# Altium project Membrane_Board.PrjPcb (part 1 of 2)
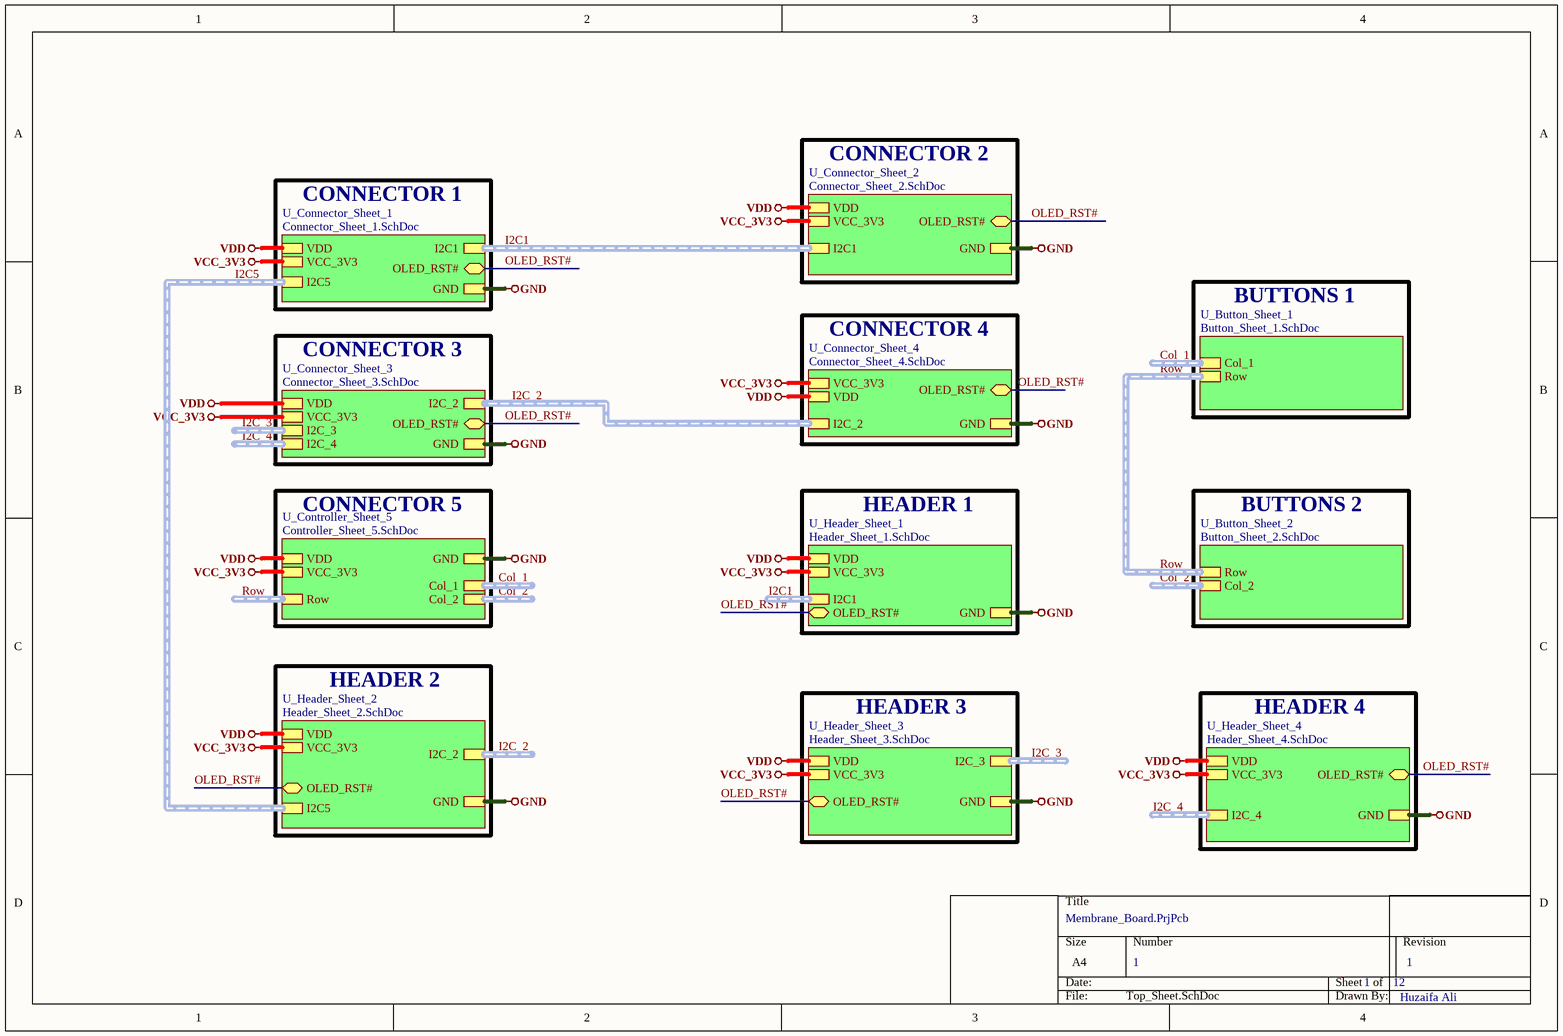
[diagram p0: Top_Sheet.SchDoc]
12 sheets, 247 parts. Net scope: hierarchical (ports join the sheet entries above them; power ports are global).
Board file: Membrane_Board_Latest.PcbDoc
Sheets:
  Top_Sheet.SchDoc
    U_Connector_Sheet_1 = Connector_Sheet_1.SchDoc
    U_Connector_Sheet_2 = Connector_Sheet_2.SchDoc
    U_Connector_Sheet_3 = Connector_Sheet_3.SchDoc
    U_Connector_Sheet_4 = Connector_Sheet_4.SchDoc
    U_Controller_Sheet_5 = Controller_Sheet_5.SchDoc
    U_Header_Sheet_1 = Header_Sheet_1.SchDoc
    U_Header_Sheet_2 = Header_Sheet_2.SchDoc
    U_Header_Sheet_3 = Header_Sheet_3.SchDoc
    U_Header_Sheet_4 = Header_Sheet_4.SchDoc
    U_Button_Sheet_1 = Button_Sheet_1.SchDoc
    U_Button_Sheet_2 = Button_Sheet_2.SchDoc

## Sheet Top_Sheet.SchDoc
size A4; SheetNumber: 1; SheetTotal: 12

### Sub-sheets
U_Button_Sheet_1 = Button_Sheet_1.SchDoc: Col_1 (harness Col_1), Row (harness Row)
U_Button_Sheet_2 = Button_Sheet_2.SchDoc: Col_2 (harness Col_2), Row (harness Row)
U_Connector_Sheet_1 = Connector_Sheet_1.SchDoc: I2C1 (harness I2C1), VDD, VCC_3V3, GND, OLED_RST# (bidir), I2C5 (harness I2C5)
U_Connector_Sheet_2 = Connector_Sheet_2.SchDoc: I2C1 (harness I2C1), VDD, VCC_3V3, GND, OLED_RST# (bidir)
U_Connector_Sheet_3 = Connector_Sheet_3.SchDoc: VDD, VCC_3V3, GND, I2C_2 (harness I2C_2), OLED_RST# (bidir), I2C_3 (harness I2C_3), I2C_4 (harness I2C_4)
U_Connector_Sheet_4 = Connector_Sheet_4.SchDoc: I2C_2 (harness I2C_2), VDD, VCC_3V3, GND, OLED_RST# (bidir)
U_Controller_Sheet_5 = Controller_Sheet_5.SchDoc: VDD, VCC_3V3, GND, Col_1 (harness Col_1), Row (harness Row), Col_2 (harness Col_2)
U_Header_Sheet_1 = Header_Sheet_1.SchDoc: VDD, VCC_3V3, GND, I2C1 (harness I2C1), OLED_RST# (bidir)
U_Header_Sheet_2 = Header_Sheet_2.SchDoc: VDD, VCC_3V3, GND, OLED_RST# (bidir), I2C_2 (harness I2C_2), I2C5 (harness I2C5)
U_Header_Sheet_3 = Header_Sheet_3.SchDoc: I2C_3 (harness I2C_3), VDD, VCC_3V3, GND, OLED_RST# (bidir)
U_Header_Sheet_4 = Header_Sheet_4.SchDoc: OLED_RST# (bidir), I2C_4 (harness I2C_4), VDD, VCC_3V3, GND

### Nets
GND: sheet U_Connector_Sheet_1/GND, sheet U_Connector_Sheet_2/GND, sheet U_Connector_Sheet_3/GND, sheet U_Connector_Sheet_4/GND, sheet U_Controller_Sheet_5/GND, sheet U_Header_Sheet_1/GND, sheet U_Header_Sheet_2/GND, sheet U_Header_Sheet_3/GND, sheet U_Header_Sheet_4/GND
VCC_3V3: sheet U_Connector_Sheet_1/VCC_3V3, sheet U_Connector_Sheet_2/VCC_3V3, sheet U_Connector_Sheet_3/VCC_3V3, sheet U_Connector_Sheet_4/VCC_3V3, sheet U_Controller_Sheet_5/VCC_3V3, sheet U_Header_Sheet_1/VCC_3V3, sheet U_Header_Sheet_2/VCC_3V3, sheet U_Header_Sheet_3/VCC_3V3, sheet U_Header_Sheet_4/VCC_3V3
VDD: sheet U_Connector_Sheet_1/VDD, sheet U_Connector_Sheet_2/VDD, sheet U_Connector_Sheet_3/VDD, sheet U_Connector_Sheet_4/VDD, sheet U_Controller_Sheet_5/VDD, sheet U_Header_Sheet_1/VDD, sheet U_Header_Sheet_2/VDD, sheet U_Header_Sheet_3/VDD, sheet U_Header_Sheet_4/VDD
OLED_RST#: sheet U_Connector_Sheet_1/OLED_RST#, sheet U_Connector_Sheet_2/OLED_RST#, sheet U_Connector_Sheet_3/OLED_RST#, sheet U_Connector_Sheet_4/OLED_RST#, sheet U_Header_Sheet_1/OLED_RST#, sheet U_Header_Sheet_2/OLED_RST#, sheet U_Header_Sheet_3/OLED_RST#, sheet U_Header_Sheet_4/OLED_RST#

### Buses and harness runs
harness Col_1 = sheet U_Button_Sheet_1/Col_1
harness Col_1 = sheet U_Controller_Sheet_5/Col_1
harness Col_2 = sheet U_Button_Sheet_2/Col_2
harness Col_2 = sheet U_Controller_Sheet_5/Col_2
harness I2C1 = sheet U_Connector_Sheet_1/I2C1 = sheet U_Connector_Sheet_2/I2C1
harness I2C1 = sheet U_Header_Sheet_1/I2C1
harness I2C5 = sheet U_Connector_Sheet_1/I2C5 = sheet U_Header_Sheet_2/I2C5
harness I2C_2 = sheet U_Connector_Sheet_3/I2C_2 = sheet U_Connector_Sheet_4/I2C_2
harness I2C_2 = sheet U_Header_Sheet_2/I2C_2
harness I2C_3 = sheet U_Connector_Sheet_3/I2C_3
harness I2C_3 = sheet U_Header_Sheet_3/I2C_3
harness I2C_4 = sheet U_Connector_Sheet_3/I2C_4
harness I2C_4 = sheet U_Header_Sheet_4/I2C_4
harness Row = sheet U_Button_Sheet_1/Row = sheet U_Button_Sheet_2/Row
harness Row = sheet U_Controller_Sheet_5/Row

### Notes on the sheet
- CONNECTOR 2
- CONNECTOR 1
- BUTTONS 1
- CONNECTOR 3
- CONNECTOR 4
- CONNECTOR 5
- HEADER 1
- BUTTONS 2
- HEADER 2
- HEADER 3
- HEADER 4
- 1
- Huzaifa Ali

## Sheet Connector_Sheet_1.SchDoc
size A4; SheetNumber: 2; SheetTotal: 12
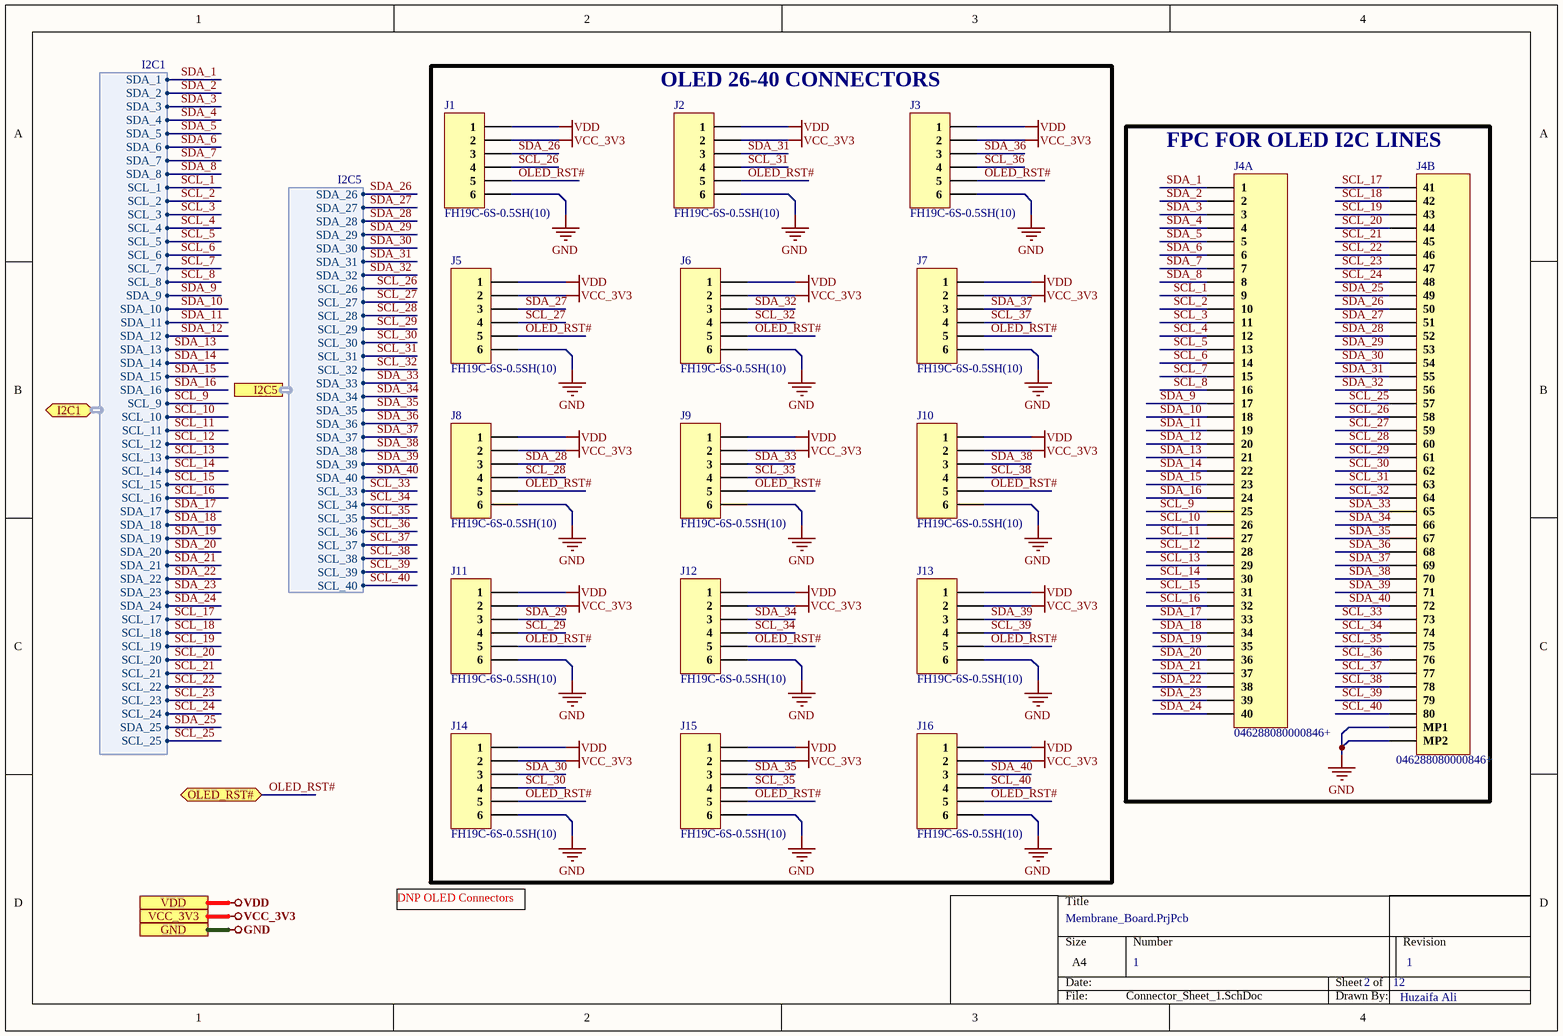
[diagram p1: Connector_Sheet_1.SchDoc]

### Parts
J1  FH19C-6S-0.5SH(10)  [FH19C-6S-0.5SH(10)]
J2  FH19C-6S-0.5SH(10)  [FH19C-6S-0.5SH(10)]
J3  FH19C-6S-0.5SH(10)  [FH19C-6S-0.5SH(10)]
J4  046288080000846+  [046288080000846+]  (parts A,B of 2)
J5  FH19C-6S-0.5SH(10)  [FH19C-6S-0.5SH(10)]
J6  FH19C-6S-0.5SH(10)  [FH19C-6S-0.5SH(10)]
J7  FH19C-6S-0.5SH(10)  [FH19C-6S-0.5SH(10)]
J8  FH19C-6S-0.5SH(10)  [FH19C-6S-0.5SH(10)]
J9  FH19C-6S-0.5SH(10)  [FH19C-6S-0.5SH(10)]
J10  FH19C-6S-0.5SH(10)  [FH19C-6S-0.5SH(10)]
J11  FH19C-6S-0.5SH(10)  [FH19C-6S-0.5SH(10)]
J12  FH19C-6S-0.5SH(10)  [FH19C-6S-0.5SH(10)]
J13  FH19C-6S-0.5SH(10)  [FH19C-6S-0.5SH(10)]
J14  FH19C-6S-0.5SH(10)  [FH19C-6S-0.5SH(10)]
J15  FH19C-6S-0.5SH(10)  [FH19C-6S-0.5SH(10)]
J16  FH19C-6S-0.5SH(10)  [FH19C-6S-0.5SH(10)]

### Blocks framed on the sheet
OLED 26-40 CONNECTORS: J1-J3 J5-J16
FPC FOR OLED I2C LINES: J4

### Ports
GND, I2C1 (bidir, harness I2C1), I2C5 (harness I2C5), OLED_RST# (bidir), VCC_3V3, VDD

### Harnesses
I2C1: SDA_1, SDA_2, SDA_3, SDA_4, SDA_5, SDA_6, SDA_7, SDA_8, SCL_1, SCL_2, SCL_3, SCL_4, SCL_5, SCL_6, SCL_7, SCL_8, SDA_9, SDA_10, SDA_11, SDA_12, SDA_13, SDA_14, SDA_15, SDA_16, SCL_9, SCL_10, SCL_11, SCL_12, SCL_13, SCL_14, SCL_15, SCL_16, SDA_17, SDA_18, SDA_19, SDA_20, SDA_21, SDA_22, SDA_23, SDA_24, SCL_17, SCL_18, SCL_19, SCL_20, SCL_21, SCL_22, SCL_23, SCL_24, SDA_25, SCL_25
I2C5: SDA_26, SDA_27, SDA_28, SDA_29, SDA_30, SDA_31, SDA_32, SCL_26, SCL_27, SCL_28, SCL_29, SCL_30, SCL_31, SCL_32, SDA_33, SDA_34, SDA_35, SDA_36, SDA_37, SDA_38, SDA_39, SDA_40, SCL_33, SCL_34, SCL_35, SCL_36, SCL_37, SCL_38, SCL_39, SCL_40

### Nets
GND: J1.6 J2.6 J3.6 J4.MP1 J4.MP2 J5.6 J6.6 J7.6 J8.6 J9.6 J10.6 J11.6 J12.6 J13.6 J14.6 J15.6 J16.6 ; port GND
VCC_3V3: J1.2 J2.2 J3.2 J5.2 J6.2 J7.2 J8.2 J9.2 J10.2 J11.2 J12.2 J13.2 J14.2 J15.2 J16.2 ; port VCC_3V3
VDD: J1.1 J2.1 J3.1 J5.1 J6.1 J7.1 J8.1 J9.1 J10.1 J11.1 J12.1 J13.1 J14.1 J15.1 J16.1 ; port VDD
OLED_RST#: J1.5 J2.5 J3.5 J5.5 J6.5 J7.5 J8.5 J9.5 J10.5 J11.5 J12.5 J13.5 J14.5 J15.5 J16.5 ; port OLED_RST#
SCL_1: J4.9 ; port I2C1.SCL_1  [project net I2C1.SCL_1]
SCL_2: J4.10 ; port I2C1.SCL_2  [project net I2C1.SCL_2]
SCL_3: J4.11 ; port I2C1.SCL_3  [project net I2C1.SCL_3]
SCL_4: J4.12 ; port I2C1.SCL_4  [project net I2C1.SCL_4]
SCL_5: J4.13 ; port I2C1.SCL_5  [project net I2C1.SCL_5]
SCL_6: J4.14 ; port I2C1.SCL_6  [project net I2C1.SCL_6]
SCL_7: J4.15 ; port I2C1.SCL_7  [project net I2C1.SCL_7]
SCL_8: J4.16 ; port I2C1.SCL_8  [project net I2C1.SCL_8]
SCL_9: J4.25 ; port I2C1.SCL_9  [project net I2C1.SCL_9]
SCL_10: J4.26 ; port I2C1.SCL_10  [project net I2C1.SCL_10]
SCL_11: J4.27 ; port I2C1.SCL_11  [project net I2C1.SCL_11]
SCL_12: J4.28 ; port I2C1.SCL_12  [project net I2C1.SCL_12]
SCL_13: J4.29 ; port I2C1.SCL_13  [project net I2C1.SCL_13]
SCL_14: J4.30 ; port I2C1.SCL_14  [project net I2C1.SCL_14]
SCL_15: J4.31 ; port I2C1.SCL_15  [project net I2C1.SCL_15]
SCL_16: J4.32 ; port I2C1.SCL_16  [project net I2C1.SCL_16]
SCL_17: J4.41 ; port I2C1.SCL_17  [project net I2C1.SCL_17]
SCL_18: J4.42 ; port I2C1.SCL_18  [project net I2C1.SCL_18]
SCL_19: J4.43 ; port I2C1.SCL_19  [project net I2C1.SCL_19]
SCL_20: J4.44 ; port I2C1.SCL_20  [project net I2C1.SCL_20]
SCL_21: J4.45 ; port I2C1.SCL_21  [project net I2C1.SCL_21]
SCL_22: J4.46 ; port I2C1.SCL_22  [project net I2C1.SCL_22]
SCL_23: J4.47 ; port I2C1.SCL_23  [project net I2C1.SCL_23]
SCL_24: J4.48 ; port I2C1.SCL_24  [project net I2C1.SCL_24]
SCL_25: J4.57 ; port I2C1.SCL_25  [project net I2C1.SCL_25]
SCL_26: J1.4 J4.58 ; port I2C5.SCL_26  [project net I2C5.SCL_26]
SCL_27: J4.59 J5.4 ; port I2C5.SCL_27  [project net I2C5.SCL_27]
SCL_28: J4.60 J8.4 ; port I2C5.SCL_28  [project net I2C5.SCL_28]
SCL_29: J4.61 J11.4 ; port I2C5.SCL_29  [project net I2C5.SCL_29]
SCL_30: J4.62 J14.4 ; port I2C5.SCL_30  [project net I2C5.SCL_30]
SCL_31: J2.4 J4.63 ; port I2C5.SCL_31  [project net I2C5.SCL_31]
SCL_32: J4.64 J6.4 ; port I2C5.SCL_32  [project net I2C5.SCL_32]
SCL_33: J4.73 J9.4 ; port I2C5.SCL_33  [project net I2C5.SCL_33]
SCL_34: J4.74 J12.4 ; port I2C5.SCL_34  [project net I2C5.SCL_34]
SCL_35: J4.75 J15.4 ; port I2C5.SCL_35  [project net I2C5.SCL_35]
SCL_36: J3.4 J4.76 ; port I2C5.SCL_36  [project net I2C5.SCL_36]
SCL_37: J4.77 J7.4 ; port I2C5.SCL_37  [project net I2C5.SCL_37]
SCL_38: J4.78 J10.4 ; port I2C5.SCL_38  [project net I2C5.SCL_38]
SCL_39: J4.79 J13.4 ; port I2C5.SCL_39  [project net I2C5.SCL_39]
SCL_40: J4.80 J16.4 ; port I2C5.SCL_40  [project net I2C5.SCL_40]
SDA_1: J4.1 ; port I2C1.SDA_1  [project net I2C1.SDA_1]
SDA_2: J4.2 ; port I2C1.SDA_2  [project net I2C1.SDA_2]
SDA_3: J4.3 ; port I2C1.SDA_3  [project net I2C1.SDA_3]
SDA_4: J4.4 ; port I2C1.SDA_4  [project net I2C1.SDA_4]
SDA_5: J4.5 ; port I2C1.SDA_5  [project net I2C1.SDA_5]
SDA_6: J4.6 ; port I2C1.SDA_6  [project net I2C1.SDA_6]
SDA_7: J4.7 ; port I2C1.SDA_7  [project net I2C1.SDA_7]
SDA_8: J4.8 ; port I2C1.SDA_8  [project net I2C1.SDA_8]
SDA_9: J4.17 ; port I2C1.SDA_9  [project net I2C1.SDA_9]
SDA_10: J4.18 ; port I2C1.SDA_10  [project net I2C1.SDA_10]
SDA_11: J4.19 ; port I2C1.SDA_11  [project net I2C1.SDA_11]
SDA_12: J4.20 ; port I2C1.SDA_12  [project net I2C1.SDA_12]
SDA_13: J4.21 ; port I2C1.SDA_13  [project net I2C1.SDA_13]
SDA_14: J4.22 ; port I2C1.SDA_14  [project net I2C1.SDA_14]
SDA_15: J4.23 ; port I2C1.SDA_15  [project net I2C1.SDA_15]
SDA_16: J4.24 ; port I2C1.SDA_16  [project net I2C1.SDA_16]
SDA_17: J4.33 ; port I2C1.SDA_17  [project net I2C1.SDA_17]
SDA_18: J4.34 ; port I2C1.SDA_18  [project net I2C1.SDA_18]
SDA_19: J4.35 ; port I2C1.SDA_19  [project net I2C1.SDA_19]
SDA_20: J4.36 ; port I2C1.SDA_20  [project net I2C1.SDA_20]
SDA_21: J4.37 ; port I2C1.SDA_21  [project net I2C1.SDA_21]
SDA_22: J4.38 ; port I2C1.SDA_22  [project net I2C1.SDA_22]
SDA_23: J4.39 ; port I2C1.SDA_23  [project net I2C1.SDA_23]
SDA_24: J4.40 ; port I2C1.SDA_24  [project net I2C1.SDA_24]
SDA_25: J4.49 ; port I2C1.SDA_25  [project net I2C1.SDA_25]
SDA_26: J1.3 J4.50 ; port I2C5.SDA_26  [project net I2C5.SDA_26]
SDA_27: J4.51 J5.3 ; port I2C5.SDA_27  [project net I2C5.SDA_27]
SDA_28: J4.52 J8.3 ; port I2C5.SDA_28  [project net I2C5.SDA_28]
SDA_29: J4.53 J11.3 ; port I2C5.SDA_29  [project net I2C5.SDA_29]
SDA_30: J4.54 J14.3 ; port I2C5.SDA_30  [project net I2C5.SDA_30]
SDA_31: J2.3 J4.55 ; port I2C5.SDA_31  [project net I2C5.SDA_31]
SDA_32: J4.56 J6.3 ; port I2C5.SDA_32  [project net I2C5.SDA_32]
SDA_33: J4.65 J9.3 ; port I2C5.SDA_33  [project net I2C5.SDA_33]
SDA_34: J4.66 J12.3 ; port I2C5.SDA_34  [project net I2C5.SDA_34]
SDA_35: J4.67 J15.3 ; port I2C5.SDA_35  [project net I2C5.SDA_35]
SDA_36: J3.3 J4.68 ; port I2C5.SDA_36  [project net I2C5.SDA_36]
SDA_37: J4.69 J7.3 ; port I2C5.SDA_37  [project net I2C5.SDA_37]
SDA_38: J4.70 J10.3 ; port I2C5.SDA_38  [project net I2C5.SDA_38]
SDA_39: J4.71 J13.3 ; port I2C5.SDA_39  [project net I2C5.SDA_39]
SDA_40: J4.72 J16.3 ; port I2C5.SDA_40  [project net I2C5.SDA_40]

### Notes on the sheet
- DNP OLED Connectors
- 1
- Huzaifa Ali

### Library data of the parts
J1-J3 J5-J16 = FH19C-6S-0.5SH(10): 0.5mm Pitch, 0.9mm Height, No of Contact 4-50, FPC/FFC Connector, 0.5 A, -55 to 85 ℃, RoHS; Manufacturer: Hirose; Supplier 1: Digi-Key; Manufacturer Part Number: FH19C-6S-0.5SH(10); RoHS: Yes; Category: FFC / FPC; Stock 1: 1159; Pricing 1: 1=1.10000, 10=0.96900, 25=0.91200, 50=0.87400, 100=0.83600, 250=0.76000, 500=0.68400, 1000=0.60800, 2500=0.55100 (USD); ComponentLink1URL: https://datasheet.ciiva.com/18563/ed-fh19cfh19sc-20140305-18563530.pdf?src-supplier=Digi-Key; ComponentLink1Description: https://datasheet.ciiva.com/18563/ed-fh19cfh19sc-20140305-18563530.pdf?src-supplier=Digi-Key; Supplier Part Number 1: H125824CT-ND
J4 = 046288080000846+: 0.5MM PITCH - 80 POS - RIGHT ANG; Manufacturer: Kyocera AVX; Manufacturer Part No: 046288080000846+; Package: Custom; ComponentLink1Description: LCSC; ComponentLink1URL: https://lcsc.com/product-detail/FFC-span-style-background-color-ff0-FPC-span-Connectors_Kyocera-046288080000846_C513346.html

## Sheet Connector_Sheet_2.SchDoc
size A4; SheetNumber: 3; SheetTotal: 12
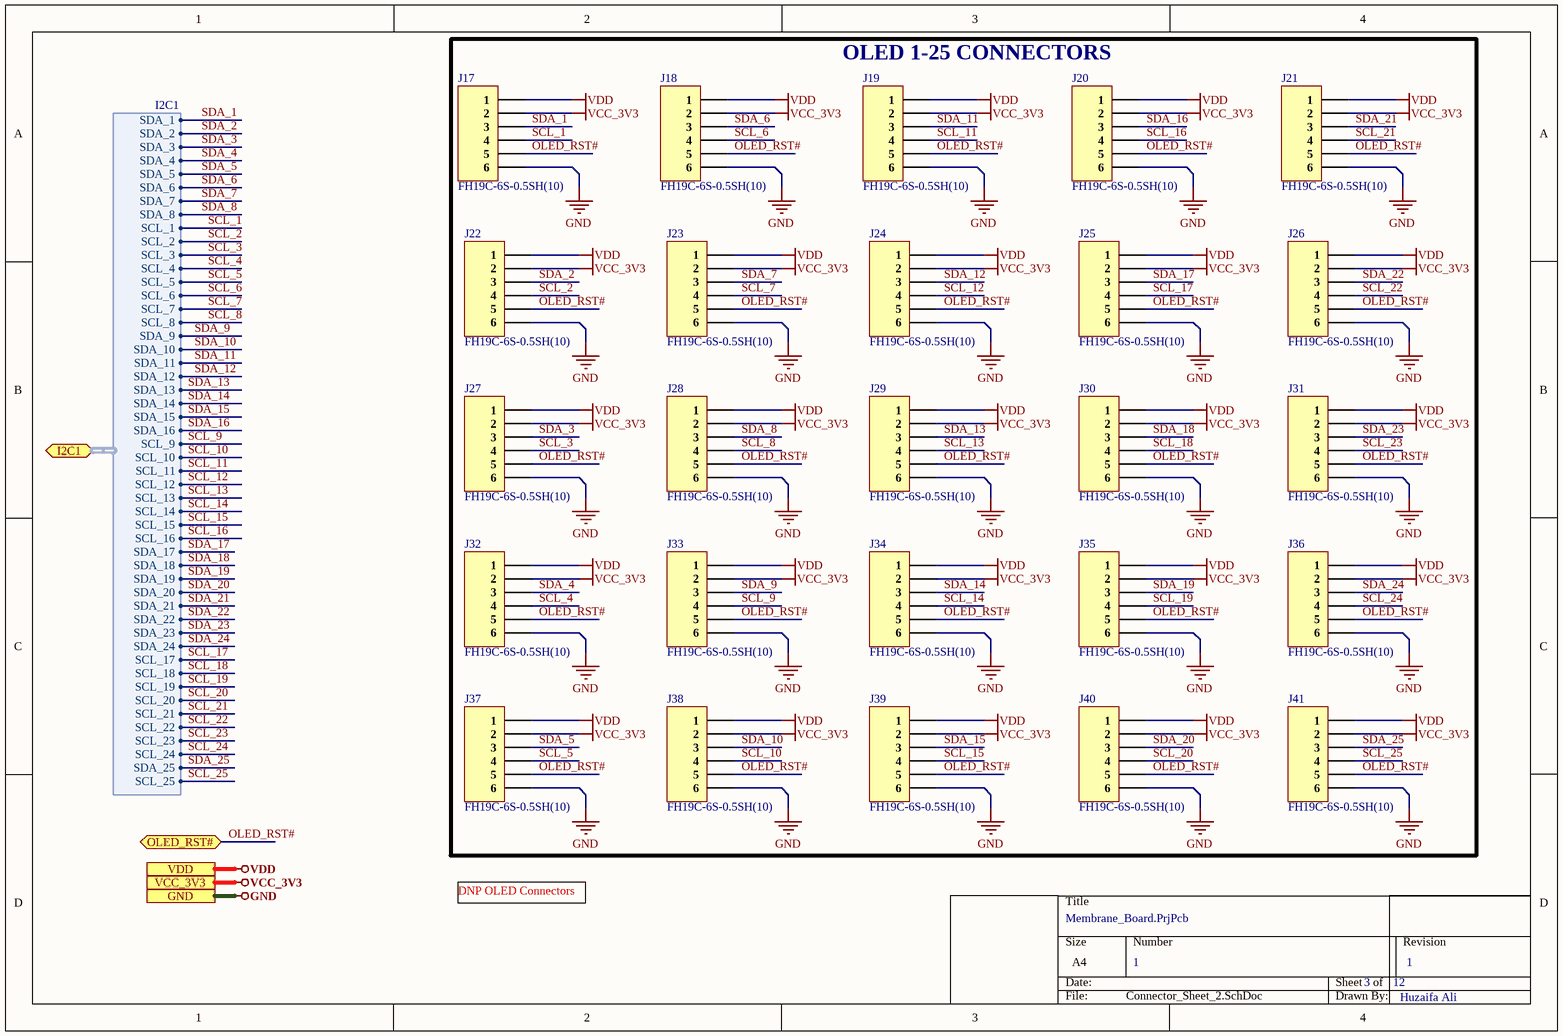
[diagram p2: Connector_Sheet_2.SchDoc]

### Parts
J17  FH19C-6S-0.5SH(10)  [FH19C-6S-0.5SH(10)]
J18  FH19C-6S-0.5SH(10)  [FH19C-6S-0.5SH(10)]
J19  FH19C-6S-0.5SH(10)  [FH19C-6S-0.5SH(10)]
J20  FH19C-6S-0.5SH(10)  [FH19C-6S-0.5SH(10)]
J21  FH19C-6S-0.5SH(10)  [FH19C-6S-0.5SH(10)]
J22  FH19C-6S-0.5SH(10)  [FH19C-6S-0.5SH(10)]
J23  FH19C-6S-0.5SH(10)  [FH19C-6S-0.5SH(10)]
J24  FH19C-6S-0.5SH(10)  [FH19C-6S-0.5SH(10)]
J25  FH19C-6S-0.5SH(10)  [FH19C-6S-0.5SH(10)]
J26  FH19C-6S-0.5SH(10)  [FH19C-6S-0.5SH(10)]
J27  FH19C-6S-0.5SH(10)  [FH19C-6S-0.5SH(10)]
J28  FH19C-6S-0.5SH(10)  [FH19C-6S-0.5SH(10)]
J29  FH19C-6S-0.5SH(10)  [FH19C-6S-0.5SH(10)]
J30  FH19C-6S-0.5SH(10)  [FH19C-6S-0.5SH(10)]
J31  FH19C-6S-0.5SH(10)  [FH19C-6S-0.5SH(10)]
J32  FH19C-6S-0.5SH(10)  [FH19C-6S-0.5SH(10)]
J33  FH19C-6S-0.5SH(10)  [FH19C-6S-0.5SH(10)]
J34  FH19C-6S-0.5SH(10)  [FH19C-6S-0.5SH(10)]
J35  FH19C-6S-0.5SH(10)  [FH19C-6S-0.5SH(10)]
J36  FH19C-6S-0.5SH(10)  [FH19C-6S-0.5SH(10)]
J37  FH19C-6S-0.5SH(10)  [FH19C-6S-0.5SH(10)]
J38  FH19C-6S-0.5SH(10)  [FH19C-6S-0.5SH(10)]
J39  FH19C-6S-0.5SH(10)  [FH19C-6S-0.5SH(10)]
J40  FH19C-6S-0.5SH(10)  [FH19C-6S-0.5SH(10)]
J41  FH19C-6S-0.5SH(10)  [FH19C-6S-0.5SH(10)]

### Blocks framed on the sheet
OLED 1-25 CONNECTORS: J17-J41

### Ports
GND, I2C1 (bidir, harness I2C1), OLED_RST# (bidir), VCC_3V3, VDD

### Harnesses
I2C1: SDA_1, SDA_2, SDA_3, SDA_4, SDA_5, SDA_6, SDA_7, SDA_8, SCL_1, SCL_2, SCL_3, SCL_4, SCL_5, SCL_6, SCL_7, SCL_8, SDA_9, SDA_10, SDA_11, SDA_12, SDA_13, SDA_14, SDA_15, SDA_16, SCL_9, SCL_10, SCL_11, SCL_12, SCL_13, SCL_14, SCL_15, SCL_16, SDA_17, SDA_18, SDA_19, SDA_20, SDA_21, SDA_22, SDA_23, SDA_24, SCL_17, SCL_18, SCL_19, SCL_20, SCL_21, SCL_22, SCL_23, SCL_24, SDA_25, SCL_25

### Nets
GND: J17.6 J18.6 J19.6 J20.6 J21.6 J22.6 J23.6 J24.6 J25.6 J26.6 J27.6 J28.6 J29.6 J30.6 J31.6 J32.6 J33.6 J34.6 J35.6 J36.6 J37.6 J38.6 J39.6 J40.6 J41.6 ; port GND
VCC_3V3: J17.2 J18.2 J19.2 J20.2 J21.2 J22.2 J23.2 J24.2 J25.2 J26.2 J27.2 J28.2 J29.2 J30.2 J31.2 J32.2 J33.2 J34.2 J35.2 J36.2 J37.2 J38.2 J39.2 J40.2 J41.2 ; port VCC_3V3
VDD: J17.1 J18.1 J19.1 J20.1 J21.1 J22.1 J23.1 J24.1 J25.1 J26.1 J27.1 J28.1 J29.1 J30.1 J31.1 J32.1 J33.1 J34.1 J35.1 J36.1 J37.1 J38.1 J39.1 J40.1 J41.1 ; port VDD
OLED_RST#: J17.5 J18.5 J19.5 J20.5 J21.5 J22.5 J23.5 J24.5 J25.5 J26.5 J27.5 J28.5 J29.5 J30.5 J31.5 J32.5 J33.5 J34.5 J35.5 J36.5 J37.5 J38.5 J39.5 J40.5 J41.5 ; port OLED_RST#
SCL_1: J17.4 ; port I2C1.SCL_1  [project net I2C1.SCL_1]
SCL_2: J22.4 ; port I2C1.SCL_2  [project net I2C1.SCL_2]
SCL_3: J27.4 ; port I2C1.SCL_3  [project net I2C1.SCL_3]
SCL_4: J32.4 ; port I2C1.SCL_4  [project net I2C1.SCL_4]
SCL_5: J37.4 ; port I2C1.SCL_5  [project net I2C1.SCL_5]
SCL_6: J18.4 ; port I2C1.SCL_6  [project net I2C1.SCL_6]
SCL_7: J23.4 ; port I2C1.SCL_7  [project net I2C1.SCL_7]
SCL_8: J28.4 ; port I2C1.SCL_8  [project net I2C1.SCL_8]
SCL_9: J33.4 ; port I2C1.SCL_9  [project net I2C1.SCL_9]
SCL_10: J38.4 ; port I2C1.SCL_10  [project net I2C1.SCL_10]
SCL_11: J19.4 ; port I2C1.SCL_11  [project net I2C1.SCL_11]
SCL_12: J24.4 ; port I2C1.SCL_12  [project net I2C1.SCL_12]
SCL_13: J29.4 ; port I2C1.SCL_13  [project net I2C1.SCL_13]
SCL_14: J34.4 ; port I2C1.SCL_14  [project net I2C1.SCL_14]
SCL_15: J39.4 ; port I2C1.SCL_15  [project net I2C1.SCL_15]
SCL_16: J20.4 ; port I2C1.SCL_16  [project net I2C1.SCL_16]
SCL_17: J25.4 ; port I2C1.SCL_17  [project net I2C1.SCL_17]
SCL_18: J30.4 ; port I2C1.SCL_18  [project net I2C1.SCL_18]
SCL_19: J35.4 ; port I2C1.SCL_19  [project net I2C1.SCL_19]
SCL_20: J40.4 ; port I2C1.SCL_20  [project net I2C1.SCL_20]
SCL_21: J21.4 ; port I2C1.SCL_21  [project net I2C1.SCL_21]
SCL_22: J26.4 ; port I2C1.SCL_22  [project net I2C1.SCL_22]
SCL_23: J31.4 ; port I2C1.SCL_23  [project net I2C1.SCL_23]
SCL_24: J36.4 ; port I2C1.SCL_24  [project net I2C1.SCL_24]
SCL_25: J41.4 ; port I2C1.SCL_25  [project net I2C1.SCL_25]
SDA_1: J17.3 ; port I2C1.SDA_1  [project net I2C1.SDA_1]
SDA_2: J22.3 ; port I2C1.SDA_2  [project net I2C1.SDA_2]
SDA_3: J27.3 ; port I2C1.SDA_3  [project net I2C1.SDA_3]
SDA_4: J32.3 ; port I2C1.SDA_4  [project net I2C1.SDA_4]
SDA_5: J37.3 ; port I2C1.SDA_5  [project net I2C1.SDA_5]
SDA_6: J18.3 ; port I2C1.SDA_6  [project net I2C1.SDA_6]
SDA_7: J23.3 ; port I2C1.SDA_7  [project net I2C1.SDA_7]
SDA_8: J28.3 ; port I2C1.SDA_8  [project net I2C1.SDA_8]
SDA_9: J33.3 ; port I2C1.SDA_9  [project net I2C1.SDA_9]
SDA_10: J38.3 ; port I2C1.SDA_10  [project net I2C1.SDA_10]
SDA_11: J19.3 ; port I2C1.SDA_11  [project net I2C1.SDA_11]
SDA_12: J24.3 ; port I2C1.SDA_12  [project net I2C1.SDA_12]
SDA_13: J29.3 ; port I2C1.SDA_13  [project net I2C1.SDA_13]
SDA_14: J34.3 ; port I2C1.SDA_14  [project net I2C1.SDA_14]
SDA_15: J39.3 ; port I2C1.SDA_15  [project net I2C1.SDA_15]
SDA_16: J20.3 ; port I2C1.SDA_16  [project net I2C1.SDA_16]
SDA_17: J25.3 ; port I2C1.SDA_17  [project net I2C1.SDA_17]
SDA_18: J30.3 ; port I2C1.SDA_18  [project net I2C1.SDA_18]
SDA_19: J35.3 ; port I2C1.SDA_19  [project net I2C1.SDA_19]
SDA_20: J40.3 ; port I2C1.SDA_20  [project net I2C1.SDA_20]
SDA_21: J21.3 ; port I2C1.SDA_21  [project net I2C1.SDA_21]
SDA_22: J26.3 ; port I2C1.SDA_22  [project net I2C1.SDA_22]
SDA_23: J31.3 ; port I2C1.SDA_23  [project net I2C1.SDA_23]
SDA_24: J36.3 ; port I2C1.SDA_24  [project net I2C1.SDA_24]
SDA_25: J41.3 ; port I2C1.SDA_25  [project net I2C1.SDA_25]

### Notes on the sheet
- DNP OLED Connectors
- 1
- Huzaifa Ali

### Library data of the parts
J17-J41 = FH19C-6S-0.5SH(10): as J1 on sheet Connector_Sheet_1; Supplier 1: Digi-Key; Manufacturer Part Number: FH19C-6S-0.5SH(10); RoHS: Yes; Category: FFC / FPC; Stock 1: 1159; Pricing 1: 1=1.10000, 10=0.96900, 25=0.91200, 50=0.87400, 100=0.83600, 250=0.76000, 500=0.68400, 1000=0.60800, 2500=0.55100 (USD); ComponentLink1URL: https://datasheet.ciiva.com/18563/ed-fh19cfh19sc-20140305-18563530.pdf?src-supplier=Digi-Key; ComponentLink1Description: https://datasheet.ciiva.com/18563/ed-fh19cfh19sc-20140305-18563530.pdf?src-supplier=Digi-Key; Supplier Part Number 1: H125824CT-ND

## Sheet Connector_Sheet_3.SchDoc
size A4; SheetNumber: 4; SheetTotal: 12
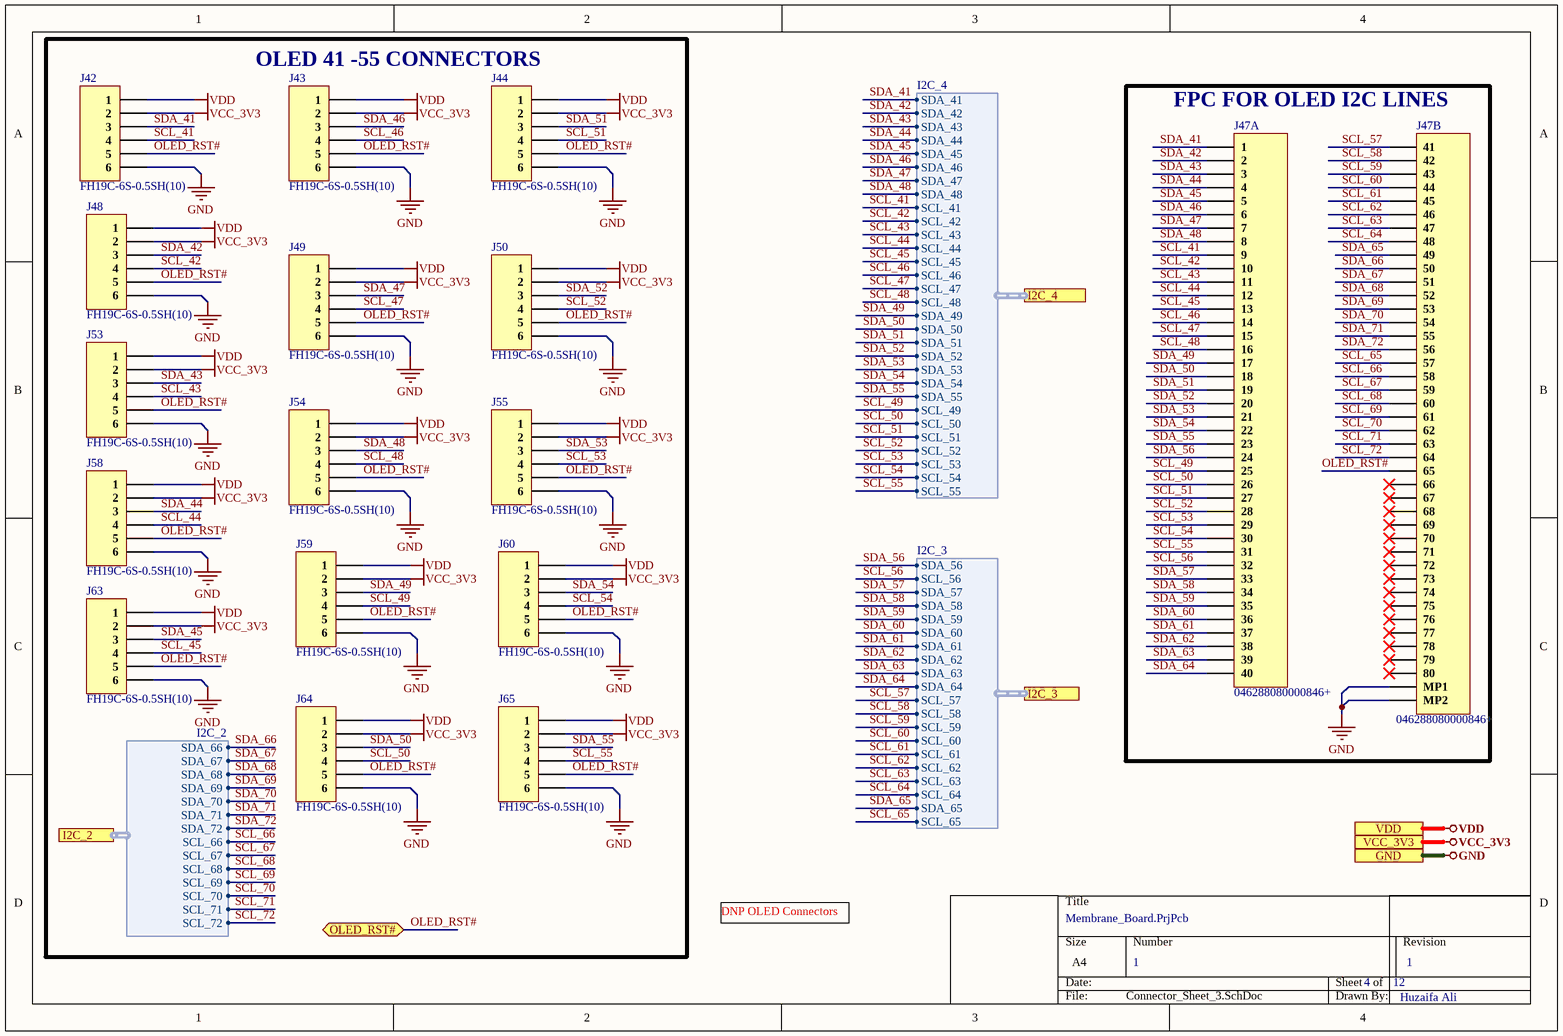
[diagram p3: Connector_Sheet_3.SchDoc]

### Parts
J42  FH19C-6S-0.5SH(10)  [FH19C-6S-0.5SH(10)]
J43  FH19C-6S-0.5SH(10)  [FH19C-6S-0.5SH(10)]
J44  FH19C-6S-0.5SH(10)  [FH19C-6S-0.5SH(10)]
J47  046288080000846+  [046288080000846+]  (parts A,B of 2)
J48  FH19C-6S-0.5SH(10)  [FH19C-6S-0.5SH(10)]
J49  FH19C-6S-0.5SH(10)  [FH19C-6S-0.5SH(10)]
J50  FH19C-6S-0.5SH(10)  [FH19C-6S-0.5SH(10)]
J53  FH19C-6S-0.5SH(10)  [FH19C-6S-0.5SH(10)]
J54  FH19C-6S-0.5SH(10)  [FH19C-6S-0.5SH(10)]
J55  FH19C-6S-0.5SH(10)  [FH19C-6S-0.5SH(10)]
J58  FH19C-6S-0.5SH(10)  [FH19C-6S-0.5SH(10)]
J59  FH19C-6S-0.5SH(10)  [FH19C-6S-0.5SH(10)]
J60  FH19C-6S-0.5SH(10)  [FH19C-6S-0.5SH(10)]
J63  FH19C-6S-0.5SH(10)  [FH19C-6S-0.5SH(10)]
J64  FH19C-6S-0.5SH(10)  [FH19C-6S-0.5SH(10)]
J65  FH19C-6S-0.5SH(10)  [FH19C-6S-0.5SH(10)]

### Blocks framed on the sheet
OLED 41 -55 CONNECTORS: J42-J44 J48-J50 J53-J55 J58-J60 J63-J65
FPC FOR OLED I2C LINES: J47

### Ports
GND, I2C_2 (harness I2C_2), I2C_3 (harness I2C_3), I2C_4 (harness I2C_4), OLED_RST# (bidir), VCC_3V3, VDD

### Harnesses
I2C_2: SDA_66, SDA_67, SDA_68, SDA_69, SDA_70, SDA_71, SDA_72, SCL_66, SCL_67, SCL_68, SCL_69, SCL_70, SCL_71, SCL_72
I2C_3: SDA_56, SCL_56, SDA_57, SDA_58, SDA_59, SDA_60, SDA_61, SDA_62, SDA_63, SDA_64, SCL_57, SCL_58, SCL_59, SCL_60, SCL_61, SCL_62, SCL_63, SCL_64, SDA_65, SCL_65
I2C_4: SDA_41, SDA_42, SDA_43, SDA_44, SDA_45, SDA_46, SDA_47, SDA_48, SCL_41, SCL_42, SCL_43, SCL_44, SCL_45, SCL_46, SCL_47, SCL_48, SDA_49, SDA_50, SDA_51, SDA_52, SDA_53, SDA_54, SDA_55, SCL_49, SCL_50, SCL_51, SCL_52, SCL_53, SCL_54, SCL_55

### Nets
GND: J42.6 J43.6 J44.6 J47.MP1 J47.MP2 J48.6 J49.6 J50.6 J53.6 J54.6 J55.6 J58.6 J59.6 J60.6 J63.6 J64.6 J65.6 ; port GND
VCC_3V3: J42.2 J43.2 J44.2 J48.2 J49.2 J50.2 J53.2 J54.2 J55.2 J58.2 J59.2 J60.2 J63.2 J64.2 J65.2 ; port VCC_3V3
VDD: J42.1 J43.1 J44.1 J48.1 J49.1 J50.1 J53.1 J54.1 J55.1 J58.1 J59.1 J60.1 J63.1 J64.1 J65.1 ; port VDD
OLED_RST#: J42.5 J43.5 J44.5 J47.65 J48.5 J49.5 J50.5 J53.5 J54.5 J55.5 J58.5 J59.5 J60.5 J63.5 J64.5 J65.5 ; port OLED_RST#
SCL_41: J42.4 J47.9 ; port I2C_4.SCL_41  [project net I2C_4.SCL_41]
SCL_42: J47.10 J48.4 ; port I2C_4.SCL_42  [project net I2C_4.SCL_42]
SCL_43: J47.11 J53.4 ; port I2C_4.SCL_43  [project net I2C_4.SCL_43]
SCL_44: J47.12 J58.4 ; port I2C_4.SCL_44  [project net I2C_4.SCL_44]
SCL_45: J47.13 J63.4 ; port I2C_4.SCL_45  [project net I2C_4.SCL_45]
SCL_46: J43.4 J47.14 ; port I2C_4.SCL_46  [project net I2C_4.SCL_46]
SCL_47: J47.15 J49.4 ; port I2C_4.SCL_47  [project net I2C_4.SCL_47]
SCL_48: J47.16 J54.4 ; port I2C_4.SCL_48  [project net I2C_4.SCL_48]
SCL_49: J47.25 J59.4 ; port I2C_4.SCL_49  [project net I2C_4.SCL_49]
SCL_50: J47.26 J64.4 ; port I2C_4.SCL_50  [project net I2C_4.SCL_50]
SCL_51: J44.4 J47.27 ; port I2C_4.SCL_51  [project net I2C_4.SCL_51]
SCL_52: J47.28 J50.4 ; port I2C_4.SCL_52  [project net I2C_4.SCL_52]
SCL_53: J47.29 J55.4 ; port I2C_4.SCL_53  [project net I2C_4.SCL_53]
SCL_54: J47.30 J60.4 ; port I2C_4.SCL_54  [project net I2C_4.SCL_54]
SCL_55: J47.31 J65.4 ; port I2C_4.SCL_55  [project net I2C_4.SCL_55]
SCL_56: J47.32 ; port I2C_3.SCL_56  [project net I2C_3.SCL_56]
SCL_57: J47.41 ; port I2C_3.SCL_57  [project net I2C_3.SCL_57]
SCL_58: J47.42 ; port I2C_3.SCL_58  [project net I2C_3.SCL_58]
SCL_59: J47.43 ; port I2C_3.SCL_59  [project net I2C_3.SCL_59]
SCL_60: J47.44 ; port I2C_3.SCL_60  [project net I2C_3.SCL_60]
SCL_61: J47.45 ; port I2C_3.SCL_61  [project net I2C_3.SCL_61]
SCL_62: J47.46 ; port I2C_3.SCL_62  [project net I2C_3.SCL_62]
SCL_63: J47.47 ; port I2C_3.SCL_63  [project net I2C_3.SCL_63]
SCL_64: J47.48 ; port I2C_3.SCL_64  [project net I2C_3.SCL_64]
SCL_65: J47.57 ; port I2C_3.SCL_65  [project net I2C_3.SCL_65]
SCL_66: J47.58 ; port I2C_2.SCL_66  [project net I2C_2.SCL_66]
SCL_67: J47.59 ; port I2C_2.SCL_67  [project net I2C_2.SCL_67]
SCL_68: J47.60 ; port I2C_2.SCL_68  [project net I2C_2.SCL_68]
SCL_69: J47.61 ; port I2C_2.SCL_69  [project net I2C_2.SCL_69]
SCL_70: J47.62 ; port I2C_2.SCL_70  [project net I2C_2.SCL_70]
SCL_71: J47.63 ; port I2C_2.SCL_71  [project net I2C_2.SCL_71]
SCL_72: J47.64 ; port I2C_2.SCL_72  [project net I2C_2.SCL_72]
SDA_41: J42.3 J47.1 ; port I2C_4.SDA_41  [project net I2C_4.SDA_41]
SDA_42: J47.2 J48.3 ; port I2C_4.SDA_42  [project net I2C_4.SDA_42]
SDA_43: J47.3 J53.3 ; port I2C_4.SDA_43  [project net I2C_4.SDA_43]
SDA_44: J47.4 J58.3 ; port I2C_4.SDA_44  [project net I2C_4.SDA_44]
SDA_45: J47.5 J63.3 ; port I2C_4.SDA_45  [project net I2C_4.SDA_45]
SDA_46: J43.3 J47.6 ; port I2C_4.SDA_46  [project net I2C_4.SDA_46]
SDA_47: J47.7 J49.3 ; port I2C_4.SDA_47  [project net I2C_4.SDA_47]
SDA_48: J47.8 J54.3 ; port I2C_4.SDA_48  [project net I2C_4.SDA_48]
SDA_49: J47.17 J59.3 ; port I2C_4.SDA_49  [project net I2C_4.SDA_49]
SDA_50: J47.18 J64.3 ; port I2C_4.SDA_50  [project net I2C_4.SDA_50]
SDA_51: J44.3 J47.19 ; port I2C_4.SDA_51  [project net I2C_4.SDA_51]
SDA_52: J47.20 J50.3 ; port I2C_4.SDA_52  [project net I2C_4.SDA_52]
SDA_53: J47.21 J55.3 ; port I2C_4.SDA_53  [project net I2C_4.SDA_53]
SDA_54: J47.22 J60.3 ; port I2C_4.SDA_54  [project net I2C_4.SDA_54]
SDA_55: J47.23 J65.3 ; port I2C_4.SDA_55  [project net I2C_4.SDA_55]
SDA_56: J47.24 ; port I2C_3.SDA_56  [project net I2C_3.SDA_56]
SDA_57: J47.33 ; port I2C_3.SDA_57  [project net I2C_3.SDA_57]
SDA_58: J47.34 ; port I2C_3.SDA_58  [project net I2C_3.SDA_58]
SDA_59: J47.35 ; port I2C_3.SDA_59  [project net I2C_3.SDA_59]
SDA_60: J47.36 ; port I2C_3.SDA_60  [project net I2C_3.SDA_60]
SDA_61: J47.37 ; port I2C_3.SDA_61  [project net I2C_3.SDA_61]
SDA_62: J47.38 ; port I2C_3.SDA_62  [project net I2C_3.SDA_62]
SDA_63: J47.39 ; port I2C_3.SDA_63  [project net I2C_3.SDA_63]
SDA_64: J47.40 ; port I2C_3.SDA_64  [project net I2C_3.SDA_64]
SDA_65: J47.49 ; port I2C_3.SDA_65  [project net I2C_3.SDA_65]
SDA_66: J47.50 ; port I2C_2.SDA_66  [project net I2C_2.SDA_66]
SDA_67: J47.51 ; port I2C_2.SDA_67  [project net I2C_2.SDA_67]
SDA_68: J47.52 ; port I2C_2.SDA_68  [project net I2C_2.SDA_68]
SDA_69: J47.53 ; port I2C_2.SDA_69  [project net I2C_2.SDA_69]
SDA_70: J47.54 ; port I2C_2.SDA_70  [project net I2C_2.SDA_70]
SDA_71: J47.55 ; port I2C_2.SDA_71  [project net I2C_2.SDA_71]
SDA_72: J47.56 ; port I2C_2.SDA_72  [project net I2C_2.SDA_72]

Not connected (* = marked no-connect by the designer): J47 66* 67* 68* 69* 70* 71* 72* 73* 74* 75* 76* 77* 78* 79* 80*

### Notes on the sheet
- DNP OLED Connectors
- 1
- Huzaifa Ali

### Library data of the parts
J42-J44 J48-J50 J53-J55 J58-J60 J63-J65 = FH19C-6S-0.5SH(10): as J1 on sheet Connector_Sheet_1; Supplier 1: Digi-Key; Manufacturer Part Number: FH19C-6S-0.5SH(10); RoHS: Yes; Category: FFC / FPC; Stock 1: 1159; Pricing 1: 1=1.10000, 10=0.96900, 25=0.91200, 50=0.87400, 100=0.83600, 250=0.76000, 500=0.68400, 1000=0.60800, 2500=0.55100 (USD); ComponentLink1URL: https://datasheet.ciiva.com/18563/ed-fh19cfh19sc-20140305-18563530.pdf?src-supplier=Digi-Key; ComponentLink1Description: https://datasheet.ciiva.com/18563/ed-fh19cfh19sc-20140305-18563530.pdf?src-supplier=Digi-Key; Supplier Part Number 1: H125824CT-ND
J47 = 046288080000846+: as J4 on sheet Connector_Sheet_1; Manufacturer Part No: 046288080000846+; Package: Custom; ComponentLink1Description: LCSC; ComponentLink1URL: https://lcsc.com/product-detail/FFC-span-style-background-color-ff0-FPC-span-Connectors_Kyocera-046288080000846_C513346.html

## Sheet Connector_Sheet_4.SchDoc
size A4; SheetNumber: 5; SheetTotal: 12
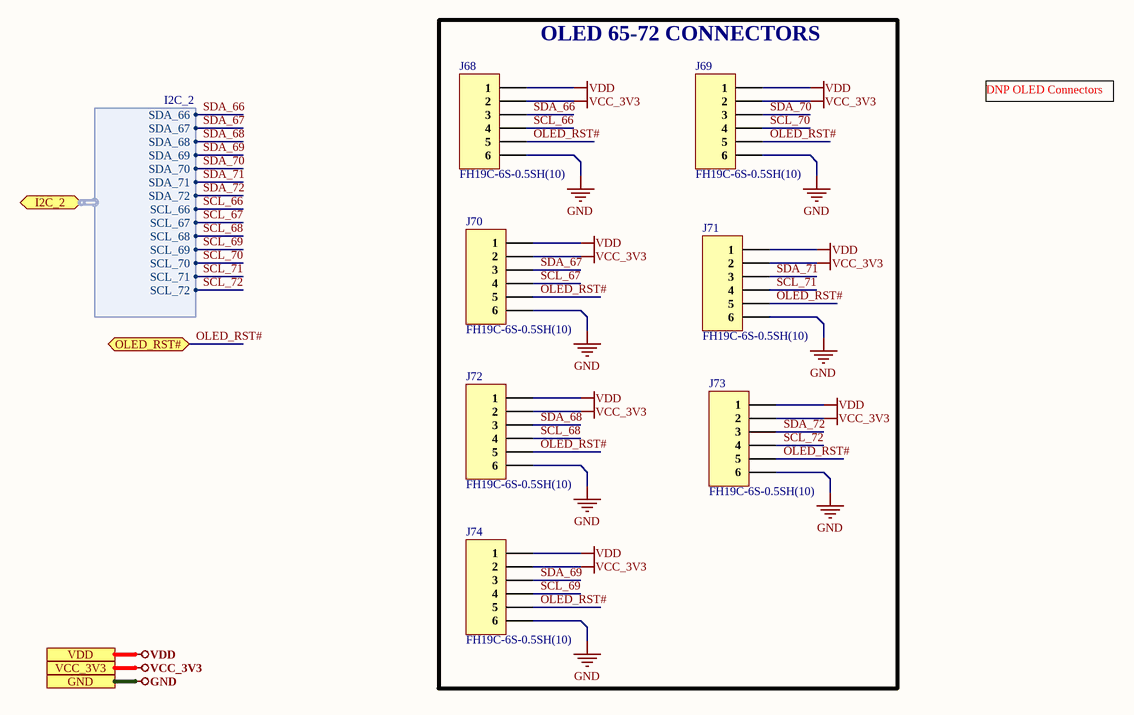
[diagram p4: Connector_Sheet_4.SchDoc]

### Parts
J68  FH19C-6S-0.5SH(10)  [FH19C-6S-0.5SH(10)]
J69  FH19C-6S-0.5SH(10)  [FH19C-6S-0.5SH(10)]
J70  FH19C-6S-0.5SH(10)  [FH19C-6S-0.5SH(10)]
J71  FH19C-6S-0.5SH(10)  [FH19C-6S-0.5SH(10)]
J72  FH19C-6S-0.5SH(10)  [FH19C-6S-0.5SH(10)]
J73  FH19C-6S-0.5SH(10)  [FH19C-6S-0.5SH(10)]
J74  FH19C-6S-0.5SH(10)  [FH19C-6S-0.5SH(10)]

### Blocks framed on the sheet
OLED 65-72 CONNECTORS: J68-J74

### Ports
GND, I2C_2 (bidir, harness I2C_2), OLED_RST# (bidir), VCC_3V3, VDD

### Harnesses
I2C_2: SDA_66, SDA_67, SDA_68, SDA_69, SDA_70, SDA_71, SDA_72, SCL_66, SCL_67, SCL_68, SCL_69, SCL_70, SCL_71, SCL_72

### Nets
GND: J68.6 J69.6 J70.6 J71.6 J72.6 J73.6 J74.6 ; port GND
VCC_3V3: J68.2 J69.2 J70.2 J71.2 J72.2 J73.2 J74.2 ; port VCC_3V3
VDD: J68.1 J69.1 J70.1 J71.1 J72.1 J73.1 J74.1 ; port VDD
OLED_RST#: J68.5 J69.5 J70.5 J71.5 J72.5 J73.5 J74.5 ; port OLED_RST#
SCL_66: J68.4 ; port I2C_2.SCL_66  [project net I2C_2.SCL_66]
SCL_67: J70.4 ; port I2C_2.SCL_67  [project net I2C_2.SCL_67]
SCL_68: J72.4 ; port I2C_2.SCL_68  [project net I2C_2.SCL_68]
SCL_69: J74.4 ; port I2C_2.SCL_69  [project net I2C_2.SCL_69]
SCL_70: J69.4 ; port I2C_2.SCL_70  [project net I2C_2.SCL_70]
SCL_71: J71.4 ; port I2C_2.SCL_71  [project net I2C_2.SCL_71]
SCL_72: J73.4 ; port I2C_2.SCL_72  [project net I2C_2.SCL_72]
SDA_66: J68.3 ; port I2C_2.SDA_66  [project net I2C_2.SDA_66]
SDA_67: J70.3 ; port I2C_2.SDA_67  [project net I2C_2.SDA_67]
SDA_68: J72.3 ; port I2C_2.SDA_68  [project net I2C_2.SDA_68]
SDA_69: J74.3 ; port I2C_2.SDA_69  [project net I2C_2.SDA_69]
SDA_70: J69.3 ; port I2C_2.SDA_70  [project net I2C_2.SDA_70]
SDA_71: J71.3 ; port I2C_2.SDA_71  [project net I2C_2.SDA_71]
SDA_72: J73.3 ; port I2C_2.SDA_72  [project net I2C_2.SDA_72]

### Notes on the sheet
- DNP OLED Connectors
- 1
- Huzaifa Ali

### Library data of the parts
J68-J74 = FH19C-6S-0.5SH(10): as J1 on sheet Connector_Sheet_1; Supplier 1: Digi-Key; Manufacturer Part Number: FH19C-6S-0.5SH(10); RoHS: Yes; Category: FFC / FPC; Stock 1: 1159; Pricing 1: 1=1.10000, 10=0.96900, 25=0.91200, 50=0.87400, 100=0.83600, 250=0.76000, 500=0.68400, 1000=0.60800, 2500=0.55100 (USD); ComponentLink1URL: https://datasheet.ciiva.com/18563/ed-fh19cfh19sc-20140305-18563530.pdf?src-supplier=Digi-Key; ComponentLink1Description: https://datasheet.ciiva.com/18563/ed-fh19cfh19sc-20140305-18563530.pdf?src-supplier=Digi-Key; Supplier Part Number 1: H125824CT-ND

## Sheet Controller_Sheet_5.SchDoc
size A4; SheetNumber: 6; SheetTotal: 12
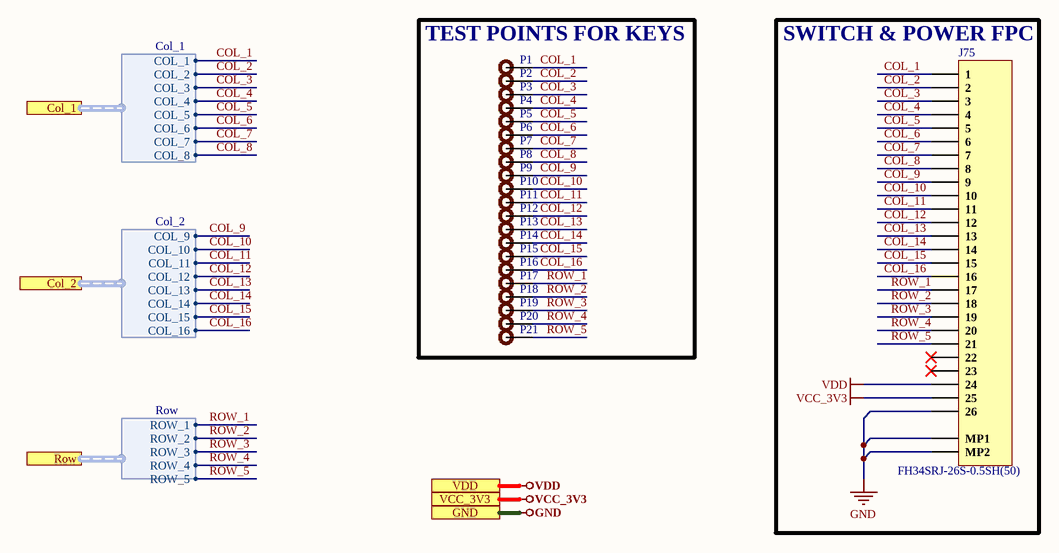
[diagram p5: Controller_Sheet_5.SchDoc]

### Parts
J75  FH34SRJ-26S-0.5SH(50)  [FH34SRJ-26S-0.5SH(50)]
P1  Test Point  [TEST POINT]  (value not drawn)
P2  Test Point  [TEST POINT]  (value not drawn)
P3  Test Point  [TEST POINT]  (value not drawn)
P4  Test Point  [TEST POINT]  (value not drawn)
P5  Test Point  [TEST POINT]  (value not drawn)
P6  Test Point  [TEST POINT]  (value not drawn)
P7  Test Point  [TEST POINT]  (value not drawn)
P8  Test Point  [TEST POINT]  (value not drawn)
P9  Test Point  [TEST POINT]  (value not drawn)
P10  Test Point  [TEST POINT]  (value not drawn)
P11  Test Point  [TEST POINT]  (value not drawn)
P12  Test Point  [TEST POINT]  (value not drawn)
P13  Test Point  [TEST POINT]  (value not drawn)
P14  Test Point  [TEST POINT]  (value not drawn)
P15  Test Point  [TEST POINT]  (value not drawn)
P16  Test Point  [TEST POINT]  (value not drawn)
P17  Test Point  [TEST POINT]  (value not drawn)
P18  Test Point  [TEST POINT]  (value not drawn)
P19  Test Point  [TEST POINT]  (value not drawn)
P20  Test Point  [TEST POINT]  (value not drawn)
P21  Test Point  [TEST POINT]  (value not drawn)

### Blocks framed on the sheet
TEST POINTS FOR KEYS: P1-P21
SWITCH & POWER FPC: J75

### Ports
Col_1 (harness Col_1), Col_2 (harness Col_2), GND, Row (harness Row), VCC_3V3, VDD

### Harnesses
Col_2: COL_16, COL_15, COL_14, COL_13, COL_12, COL_11, COL_10, COL_9
Col_1: COL_8, COL_7, COL_6, COL_5, COL_4, COL_3, COL_2, COL_1
Row: ROW_5, ROW_4, ROW_3, ROW_2, ROW_1

### Nets
GND: J75.26 J75.MP1 J75.MP2 ; port GND
VCC_3V3: J75.25 ; port VCC_3V3
VDD: J75.24 ; port VDD
COL_1: J75.1 P1.1 ; port Col_1.COL_1
COL_2: J75.2 P2.1 ; port Col_1.COL_2  [project net Col_1.COL_2]
COL_3: J75.3 P3.1 ; port Col_1.COL_3  [project net Col_1.COL_3]
COL_4: J75.4 P4.1 ; port Col_1.COL_4  [project net Col_1.COL_4]
COL_5: J75.5 P5.1 ; port Col_1.COL_5  [project net Col_1.COL_5]
COL_6: J75.6 P6.1 ; port Col_1.COL_6  [project net Col_1.COL_6]
COL_7: J75.7 P7.1 ; port Col_1.COL_7  [project net Col_1.COL_7]
COL_8: J75.8 P8.1 ; port Col_1.COL_8  [project net Col_1.COL_8]
COL_9: J75.9 P9.1 ; port Col_2.COL_9  [project net Col_2.COL_9]
COL_10: J75.10 P10.1 ; port Col_2.COL_10
COL_11: J75.11 P11.1 ; port Col_2.COL_11
COL_12: J75.12 P12.1 ; port Col_2.COL_12
COL_13: J75.13 P13.1 ; port Col_2.COL_13
COL_14: J75.14 P14.1 ; port Col_2.COL_14
COL_15: J75.15 P15.1 ; port Col_2.COL_15
COL_16: J75.16 P16.1 ; port Col_2.COL_16
ROW_1: J75.17 P17.1 ; port Row.ROW_1  [project net Row.ROW_1]
ROW_2: J75.18 P18.1 ; port Row.ROW_2  [project net Row.ROW_2]
ROW_3: J75.19 P19.1 ; port Row.ROW_3  [project net Row.ROW_3]
ROW_4: J75.20 P20.1 ; port Row.ROW_4  [project net Row.ROW_4]
ROW_5: J75.21 P21.1 ; port Row.ROW_5  [project net Row.ROW_5]

Not connected (* = marked no-connect by the designer): J75 22* 23*

### Notes on the sheet
- 1
- Huzaifa Ali

### Library data of the parts
J75 = FH34SRJ-26S-0.5SH(50): CONN FFC FPC 26POS 0.50MM R/A; Manufacturer: Hirose; Manufacturer Part Number: FH34SRJ-8S-0.5SH(99); Supplier 1: RSComponents; RoHS: Yes; Category: FFC / FPC; Stock 1: 190; Pricing 1: 5=2.79500, 25=2.28400, 100=2.17100, 250=1.96400 (USD); ComponentLink1URL: https://datasheet.ciiva.com/18561/ed-fh34s-20140305-18561974.pdf?src-supplier=Digi-Key; ComponentLink1Description: https://datasheet.ciiva.com/18561/ed-fh34s-20140305-18561974.pdf?src-supplier=Digi-Key; Supplier Part Number 1: 1362475
P1-P21 = TEST POINT: Test Point ON

## Sheet Header_Sheet_1.SchDoc
size A4; SheetNumber: 7; SheetTotal: 12
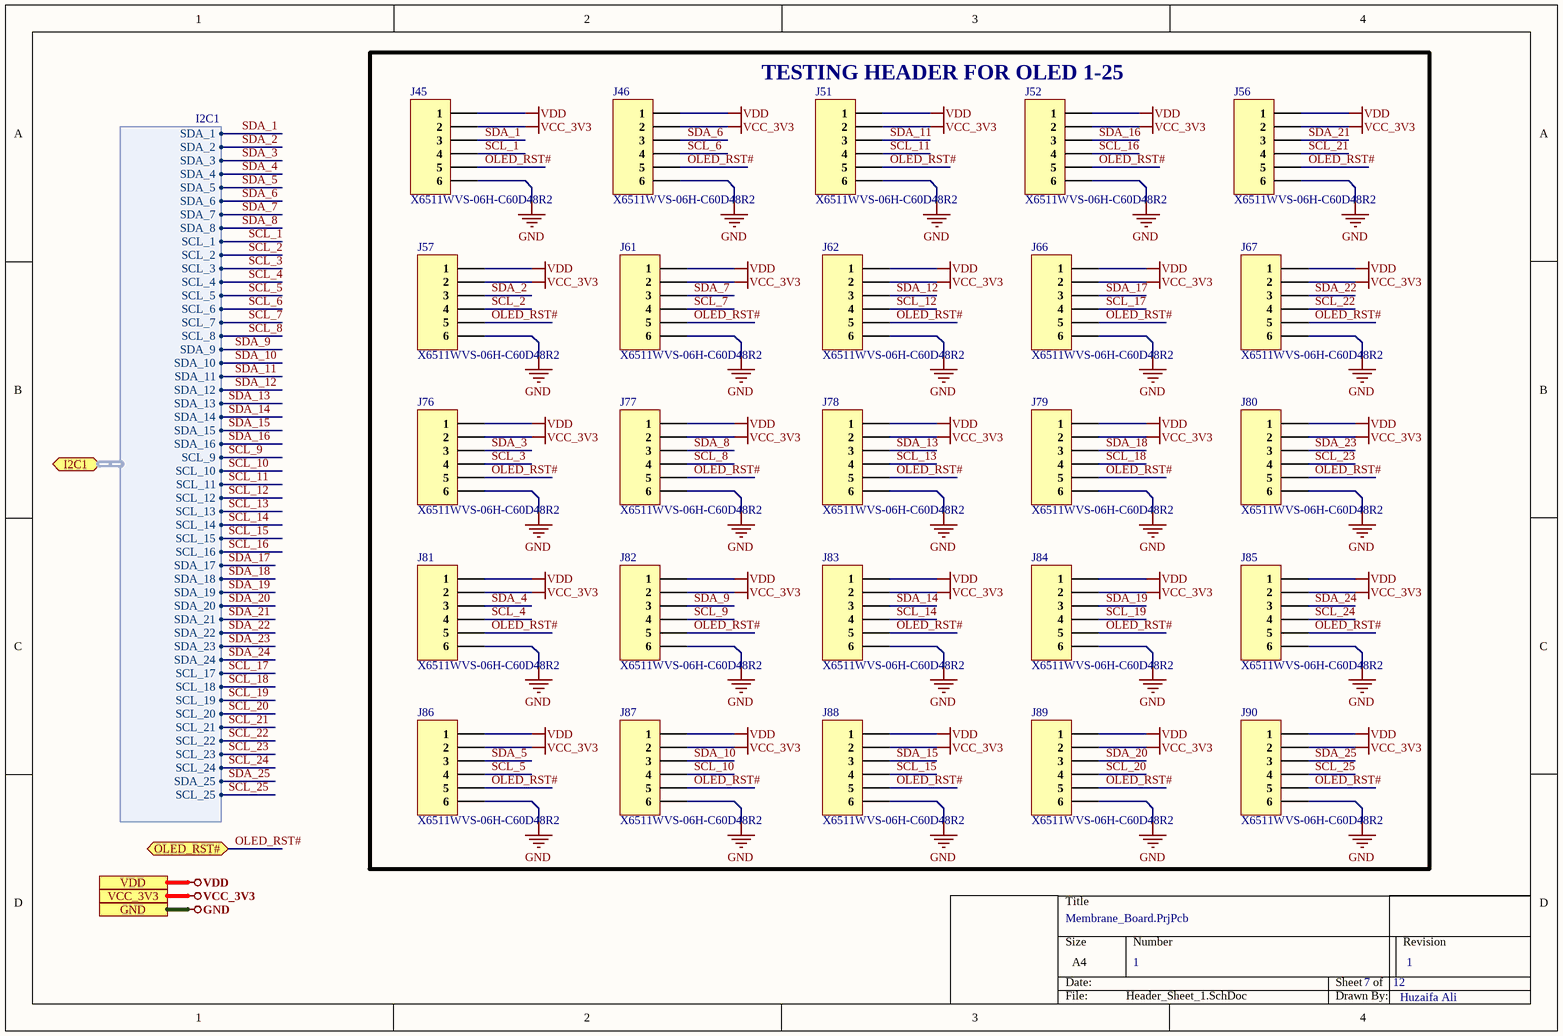
[diagram p6: Header_Sheet_1.SchDoc]

### Parts
J45  X6511WVS-06H-C60D48R2  [X6511WVS-06H-C60D48R2]
J46  X6511WVS-06H-C60D48R2  [X6511WVS-06H-C60D48R2]
J51  X6511WVS-06H-C60D48R2  [X6511WVS-06H-C60D48R2]
J52  X6511WVS-06H-C60D48R2  [X6511WVS-06H-C60D48R2]
J56  X6511WVS-06H-C60D48R2  [X6511WVS-06H-C60D48R2]
J57  X6511WVS-06H-C60D48R2  [X6511WVS-06H-C60D48R2]
J61  X6511WVS-06H-C60D48R2  [X6511WVS-06H-C60D48R2]
J62  X6511WVS-06H-C60D48R2  [X6511WVS-06H-C60D48R2]
J66  X6511WVS-06H-C60D48R2  [X6511WVS-06H-C60D48R2]
J67  X6511WVS-06H-C60D48R2  [X6511WVS-06H-C60D48R2]
J76  X6511WVS-06H-C60D48R2  [X6511WVS-06H-C60D48R2]
J77  X6511WVS-06H-C60D48R2  [X6511WVS-06H-C60D48R2]
J78  X6511WVS-06H-C60D48R2  [X6511WVS-06H-C60D48R2]
J79  X6511WVS-06H-C60D48R2  [X6511WVS-06H-C60D48R2]
J80  X6511WVS-06H-C60D48R2  [X6511WVS-06H-C60D48R2]
J81  X6511WVS-06H-C60D48R2  [X6511WVS-06H-C60D48R2]
J82  X6511WVS-06H-C60D48R2  [X6511WVS-06H-C60D48R2]
J83  X6511WVS-06H-C60D48R2  [X6511WVS-06H-C60D48R2]
J84  X6511WVS-06H-C60D48R2  [X6511WVS-06H-C60D48R2]
J85  X6511WVS-06H-C60D48R2  [X6511WVS-06H-C60D48R2]
J86  X6511WVS-06H-C60D48R2  [X6511WVS-06H-C60D48R2]
J87  X6511WVS-06H-C60D48R2  [X6511WVS-06H-C60D48R2]
J88  X6511WVS-06H-C60D48R2  [X6511WVS-06H-C60D48R2]
J89  X6511WVS-06H-C60D48R2  [X6511WVS-06H-C60D48R2]
J90  X6511WVS-06H-C60D48R2  [X6511WVS-06H-C60D48R2]

### Blocks framed on the sheet
TESTING HEADER FOR OLED 1-25: J45 J46 J51 J52 J56 J57 J61 J62 J66 J67 J76-J90

### Ports
GND, I2C1 (bidir, harness I2C1), OLED_RST# (bidir), VCC_3V3, VDD

### Harnesses
I2C1: SDA_1, SDA_2, SDA_3, SDA_4, SDA_5, SDA_6, SDA_7, SDA_8, SCL_1, SCL_2, SCL_3, SCL_4, SCL_5, SCL_6, SCL_7, SCL_8, SDA_9, SDA_10, SDA_11, SDA_12, SDA_13, SDA_14, SDA_15, SDA_16, SCL_9, SCL_10, SCL_11, SCL_12, SCL_13, SCL_14, SCL_15, SCL_16, SDA_17, SDA_18, SDA_19, SDA_20, SDA_21, SDA_22, SDA_23, SDA_24, SCL_17, SCL_18, SCL_19, SCL_20, SCL_21, SCL_22, SCL_23, SCL_24, SDA_25, SCL_25

### Nets
GND: J45.6 J46.6 J51.6 J52.6 J56.6 J57.6 J61.6 J62.6 J66.6 J67.6 J76.6 J77.6 J78.6 J79.6 J80.6 J81.6 J82.6 J83.6 J84.6 J85.6 J86.6 J87.6 J88.6 J89.6 J90.6 ; port GND
VCC_3V3: J45.2 J46.2 J51.2 J52.2 J56.2 J57.2 J61.2 J62.2 J66.2 J67.2 J76.2 J77.2 J78.2 J79.2 J80.2 J81.2 J82.2 J83.2 J84.2 J85.2 J86.2 J87.2 J88.2 J89.2 J90.2 ; port VCC_3V3
VDD: J45.1 J46.1 J51.1 J52.1 J56.1 J57.1 J61.1 J62.1 J66.1 J67.1 J76.1 J77.1 J78.1 J79.1 J80.1 J81.1 J82.1 J83.1 J84.1 J85.1 J86.1 J87.1 J88.1 J89.1 J90.1 ; port VDD
OLED_RST#: J45.5 J46.5 J51.5 J52.5 J56.5 J57.5 J61.5 J62.5 J66.5 J67.5 J76.5 J77.5 J78.5 J79.5 J80.5 J81.5 J82.5 J83.5 J84.5 J85.5 J86.5 J87.5 J88.5 J89.5 J90.5 ; port OLED_RST#
SCL_1: J45.4 ; port I2C1.SCL_1  [project net I2C1.SCL_1]
SCL_2: J57.4 ; port I2C1.SCL_2  [project net I2C1.SCL_2]
SCL_3: J76.4 ; port I2C1.SCL_3  [project net I2C1.SCL_3]
SCL_4: J81.4 ; port I2C1.SCL_4  [project net I2C1.SCL_4]
SCL_5: J86.4 ; port I2C1.SCL_5  [project net I2C1.SCL_5]
SCL_6: J46.4 ; port I2C1.SCL_6  [project net I2C1.SCL_6]
SCL_7: J61.4 ; port I2C1.SCL_7  [project net I2C1.SCL_7]
SCL_8: J77.4 ; port I2C1.SCL_8  [project net I2C1.SCL_8]
SCL_9: J82.4 ; port I2C1.SCL_9  [project net I2C1.SCL_9]
SCL_10: J87.4 ; port I2C1.SCL_10  [project net I2C1.SCL_10]
SCL_11: J51.4 ; port I2C1.SCL_11  [project net I2C1.SCL_11]
SCL_12: J62.4 ; port I2C1.SCL_12  [project net I2C1.SCL_12]
SCL_13: J78.4 ; port I2C1.SCL_13  [project net I2C1.SCL_13]
SCL_14: J83.4 ; port I2C1.SCL_14  [project net I2C1.SCL_14]
SCL_15: J88.4 ; port I2C1.SCL_15  [project net I2C1.SCL_15]
SCL_16: J52.4 ; port I2C1.SCL_16  [project net I2C1.SCL_16]
SCL_17: J66.4 ; port I2C1.SCL_17  [project net I2C1.SCL_17]
SCL_18: J79.4 ; port I2C1.SCL_18  [project net I2C1.SCL_18]
SCL_19: J84.4 ; port I2C1.SCL_19  [project net I2C1.SCL_19]
SCL_20: J89.4 ; port I2C1.SCL_20  [project net I2C1.SCL_20]
SCL_21: J56.4 ; port I2C1.SCL_21  [project net I2C1.SCL_21]
SCL_22: J67.4 ; port I2C1.SCL_22  [project net I2C1.SCL_22]
SCL_23: J80.4 ; port I2C1.SCL_23  [project net I2C1.SCL_23]
SCL_24: J85.4 ; port I2C1.SCL_24  [project net I2C1.SCL_24]
SCL_25: J90.4 ; port I2C1.SCL_25  [project net I2C1.SCL_25]
SDA_1: J45.3 ; port I2C1.SDA_1  [project net I2C1.SDA_1]
SDA_2: J57.3 ; port I2C1.SDA_2  [project net I2C1.SDA_2]
SDA_3: J76.3 ; port I2C1.SDA_3  [project net I2C1.SDA_3]
SDA_4: J81.3 ; port I2C1.SDA_4  [project net I2C1.SDA_4]
SDA_5: J86.3 ; port I2C1.SDA_5  [project net I2C1.SDA_5]
SDA_6: J46.3 ; port I2C1.SDA_6  [project net I2C1.SDA_6]
SDA_7: J61.3 ; port I2C1.SDA_7  [project net I2C1.SDA_7]
SDA_8: J77.3 ; port I2C1.SDA_8  [project net I2C1.SDA_8]
SDA_9: J82.3 ; port I2C1.SDA_9  [project net I2C1.SDA_9]
SDA_10: J87.3 ; port I2C1.SDA_10  [project net I2C1.SDA_10]
SDA_11: J51.3 ; port I2C1.SDA_11  [project net I2C1.SDA_11]
SDA_12: J62.3 ; port I2C1.SDA_12  [project net I2C1.SDA_12]
SDA_13: J78.3 ; port I2C1.SDA_13  [project net I2C1.SDA_13]
SDA_14: J83.3 ; port I2C1.SDA_14  [project net I2C1.SDA_14]
SDA_15: J88.3 ; port I2C1.SDA_15  [project net I2C1.SDA_15]
SDA_16: J52.3 ; port I2C1.SDA_16  [project net I2C1.SDA_16]
SDA_17: J66.3 ; port I2C1.SDA_17  [project net I2C1.SDA_17]
SDA_18: J79.3 ; port I2C1.SDA_18  [project net I2C1.SDA_18]
SDA_19: J84.3 ; port I2C1.SDA_19  [project net I2C1.SDA_19]
SDA_20: J89.3 ; port I2C1.SDA_20  [project net I2C1.SDA_20]
SDA_21: J56.3 ; port I2C1.SDA_21  [project net I2C1.SDA_21]
SDA_22: J67.3 ; port I2C1.SDA_22  [project net I2C1.SDA_22]
SDA_23: J80.3 ; port I2C1.SDA_23  [project net I2C1.SDA_23]
SDA_24: J85.3 ; port I2C1.SDA_24  [project net I2C1.SDA_24]
SDA_25: J90.3 ; port I2C1.SDA_25  [project net I2C1.SDA_25]

### Notes on the sheet
- 1
- Huzaifa Ali

### Library data of the parts
J45 J46 J51 J52 J56 J57 J61 J62 J66 J67 J76-J90 = X6511WVS-06H-C60D48R2: 6 POS 2.54mm SMD Header; Manufacturer: XKB Connectivity; Voltage Rating (Max): 250V; Current Rating (Max): 3A; Circluar Pins/Square Pins: Square Pins; ComponentLink1Description: LCSC; ComponentLink1URL: https://lcsc.com/product-detail/span-style-background-color-ff0-Pin-span-Headers_XKB-Connectivity-X6511WVS-06H-C60D48R2_C2883763.html; Insulation Height: 2.5mm; Length of Mating Pin: 6mm

## Sheet Header_Sheet_2.SchDoc
size A4; SheetNumber: 8; SheetTotal: 12
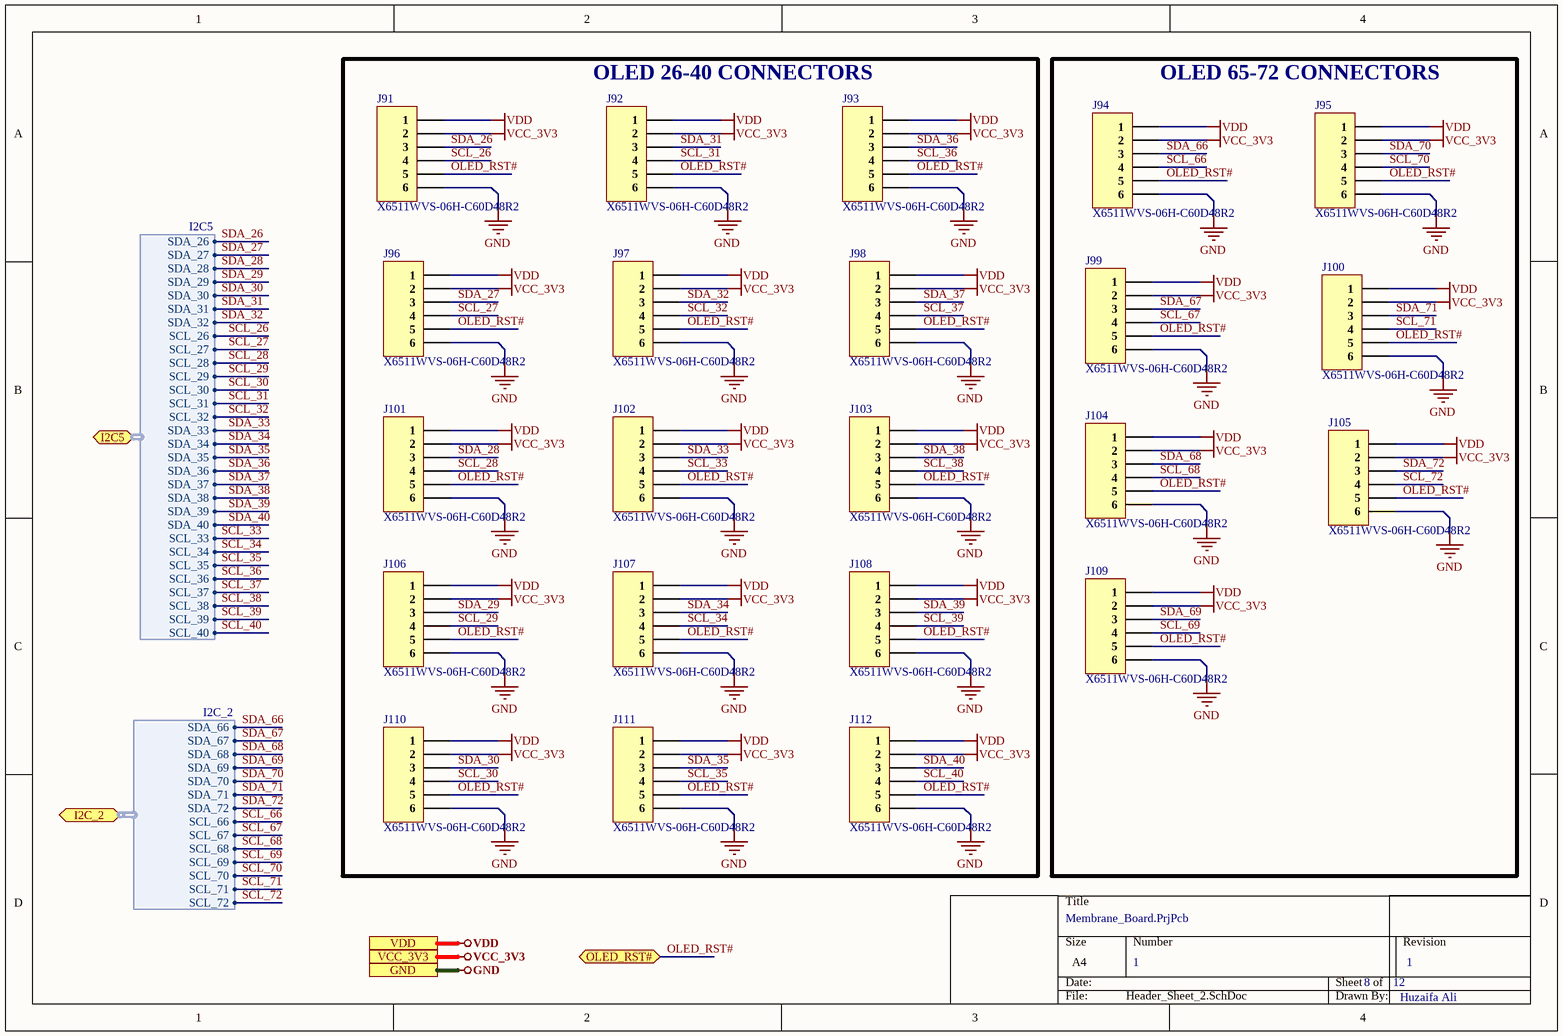
[diagram p7: Header_Sheet_2.SchDoc]

### Parts
J91  X6511WVS-06H-C60D48R2  [X6511WVS-06H-C60D48R2]
J92  X6511WVS-06H-C60D48R2  [X6511WVS-06H-C60D48R2]
J93  X6511WVS-06H-C60D48R2  [X6511WVS-06H-C60D48R2]
J94  X6511WVS-06H-C60D48R2  [X6511WVS-06H-C60D48R2]
J95  X6511WVS-06H-C60D48R2  [X6511WVS-06H-C60D48R2]
J96  X6511WVS-06H-C60D48R2  [X6511WVS-06H-C60D48R2]
J97  X6511WVS-06H-C60D48R2  [X6511WVS-06H-C60D48R2]
J98  X6511WVS-06H-C60D48R2  [X6511WVS-06H-C60D48R2]
J99  X6511WVS-06H-C60D48R2  [X6511WVS-06H-C60D48R2]
J100  X6511WVS-06H-C60D48R2  [X6511WVS-06H-C60D48R2]
J101  X6511WVS-06H-C60D48R2  [X6511WVS-06H-C60D48R2]
J102  X6511WVS-06H-C60D48R2  [X6511WVS-06H-C60D48R2]
J103  X6511WVS-06H-C60D48R2  [X6511WVS-06H-C60D48R2]
J104  X6511WVS-06H-C60D48R2  [X6511WVS-06H-C60D48R2]
J105  X6511WVS-06H-C60D48R2  [X6511WVS-06H-C60D48R2]
J106  X6511WVS-06H-C60D48R2  [X6511WVS-06H-C60D48R2]
J107  X6511WVS-06H-C60D48R2  [X6511WVS-06H-C60D48R2]
J108  X6511WVS-06H-C60D48R2  [X6511WVS-06H-C60D48R2]
J109  X6511WVS-06H-C60D48R2  [X6511WVS-06H-C60D48R2]
J110  X6511WVS-06H-C60D48R2  [X6511WVS-06H-C60D48R2]
J111  X6511WVS-06H-C60D48R2  [X6511WVS-06H-C60D48R2]
J112  X6511WVS-06H-C60D48R2  [X6511WVS-06H-C60D48R2]

### Blocks framed on the sheet
OLED 26-40 CONNECTORS: J91-J93 J96-J98 J101-J103 J106-J108 J110-J112
OLED 65-72 CONNECTORS: J94 J95 J99 J100 J104 J105 J109

### Ports
GND, I2C5 (bidir, harness I2C5), I2C_2 (bidir, harness I2C_2), OLED_RST# (bidir), VCC_3V3, VDD

### Harnesses
I2C_2: SDA_66, SDA_67, SDA_68, SDA_69, SDA_70, SDA_71, SDA_72, SCL_66, SCL_67, SCL_68, SCL_69, SCL_70, SCL_71, SCL_72
I2C5: SDA_26, SDA_27, SDA_28, SDA_29, SDA_30, SDA_31, SDA_32, SCL_26, SCL_27, SCL_28, SCL_29, SCL_30, SCL_31, SCL_32, SDA_33, SDA_34, SDA_35, SDA_36, SDA_37, SDA_38, SDA_39, SDA_40, SCL_33, SCL_34, SCL_35, SCL_36, SCL_37, SCL_38, SCL_39, SCL_40

### Nets
GND: J91.6 J92.6 J93.6 J94.6 J95.6 J96.6 J97.6 J98.6 J99.6 J100.6 J101.6 J102.6 J103.6 J104.6 J105.6 J106.6 J107.6 J108.6 J109.6 J110.6 J111.6 J112.6 ; port GND
VCC_3V3: J91.2 J92.2 J93.2 J94.2 J95.2 J96.2 J97.2 J98.2 J99.2 J100.2 J101.2 J102.2 J103.2 J104.2 J105.2 J106.2 J107.2 J108.2 J109.2 J110.2 J111.2 J112.2 ; port VCC_3V3
VDD: J91.1 J92.1 J93.1 J94.1 J95.1 J96.1 J97.1 J98.1 J99.1 J100.1 J101.1 J102.1 J103.1 J104.1 J105.1 J106.1 J107.1 J108.1 J109.1 J110.1 J111.1 J112.1 ; port VDD
OLED_RST#: J91.5 J92.5 J93.5 J94.5 J95.5 J96.5 J97.5 J98.5 J99.5 J100.5 J101.5 J102.5 J103.5 J104.5 J105.5 J106.5 J107.5 J108.5 J109.5 J110.5 J111.5 J112.5 ; port OLED_RST#
SCL_26: J91.4 ; port I2C5.SCL_26  [project net I2C5.SCL_26]
SCL_27: J96.4 ; port I2C5.SCL_27  [project net I2C5.SCL_27]
SCL_28: J101.4 ; port I2C5.SCL_28  [project net I2C5.SCL_28]
SCL_29: J106.4 ; port I2C5.SCL_29  [project net I2C5.SCL_29]
SCL_30: J110.4 ; port I2C5.SCL_30  [project net I2C5.SCL_30]
SCL_31: J92.4 ; port I2C5.SCL_31  [project net I2C5.SCL_31]
SCL_32: J97.4 ; port I2C5.SCL_32  [project net I2C5.SCL_32]
SCL_33: J102.4 ; port I2C5.SCL_33  [project net I2C5.SCL_33]
SCL_34: J107.4 ; port I2C5.SCL_34  [project net I2C5.SCL_34]
SCL_35: J111.4 ; port I2C5.SCL_35  [project net I2C5.SCL_35]
SCL_36: J93.4 ; port I2C5.SCL_36  [project net I2C5.SCL_36]
SCL_37: J98.4 ; port I2C5.SCL_37  [project net I2C5.SCL_37]
SCL_38: J103.4 ; port I2C5.SCL_38  [project net I2C5.SCL_38]
SCL_39: J108.4 ; port I2C5.SCL_39  [project net I2C5.SCL_39]
SCL_40: J112.4 ; port I2C5.SCL_40  [project net I2C5.SCL_40]
SCL_66: J94.4 ; port I2C_2.SCL_66  [project net I2C_2.SCL_66]
SCL_67: J99.4 ; port I2C_2.SCL_67  [project net I2C_2.SCL_67]
SCL_68: J104.4 ; port I2C_2.SCL_68  [project net I2C_2.SCL_68]
SCL_69: J109.4 ; port I2C_2.SCL_69  [project net I2C_2.SCL_69]
SCL_70: J95.4 ; port I2C_2.SCL_70  [project net I2C_2.SCL_70]
SCL_71: J100.4 ; port I2C_2.SCL_71  [project net I2C_2.SCL_71]
SCL_72: J105.4 ; port I2C_2.SCL_72  [project net I2C_2.SCL_72]
SDA_26: J91.3 ; port I2C5.SDA_26  [project net I2C5.SDA_26]
SDA_27: J96.3 ; port I2C5.SDA_27  [project net I2C5.SDA_27]
SDA_28: J101.3 ; port I2C5.SDA_28  [project net I2C5.SDA_28]
SDA_29: J106.3 ; port I2C5.SDA_29  [project net I2C5.SDA_29]
SDA_30: J110.3 ; port I2C5.SDA_30  [project net I2C5.SDA_30]
SDA_31: J92.3 ; port I2C5.SDA_31  [project net I2C5.SDA_31]
SDA_32: J97.3 ; port I2C5.SDA_32  [project net I2C5.SDA_32]
SDA_33: J102.3 ; port I2C5.SDA_33  [project net I2C5.SDA_33]
SDA_34: J107.3 ; port I2C5.SDA_34  [project net I2C5.SDA_34]
SDA_35: J111.3 ; port I2C5.SDA_35  [project net I2C5.SDA_35]
SDA_36: J93.3 ; port I2C5.SDA_36  [project net I2C5.SDA_36]
SDA_37: J98.3 ; port I2C5.SDA_37  [project net I2C5.SDA_37]
SDA_38: J103.3 ; port I2C5.SDA_38  [project net I2C5.SDA_38]
SDA_39: J108.3 ; port I2C5.SDA_39  [project net I2C5.SDA_39]
SDA_40: J112.3 ; port I2C5.SDA_40  [project net I2C5.SDA_40]
SDA_66: J94.3 ; port I2C_2.SDA_66  [project net I2C_2.SDA_66]
SDA_67: J99.3 ; port I2C_2.SDA_67  [project net I2C_2.SDA_67]
SDA_68: J104.3 ; port I2C_2.SDA_68  [project net I2C_2.SDA_68]
SDA_69: J109.3 ; port I2C_2.SDA_69  [project net I2C_2.SDA_69]
SDA_70: J95.3 ; port I2C_2.SDA_70  [project net I2C_2.SDA_70]
SDA_71: J100.3 ; port I2C_2.SDA_71  [project net I2C_2.SDA_71]
SDA_72: J105.3 ; port I2C_2.SDA_72  [project net I2C_2.SDA_72]

### Notes on the sheet
- 1
- Huzaifa Ali

### Library data of the parts
J91-J112 = X6511WVS-06H-C60D48R2: as J45 on sheet Header_Sheet_1; ComponentLink1Description: LCSC; ComponentLink1URL: https://lcsc.com/product-detail/span-style-background-color-ff0-Pin-span-Headers_XKB-Connectivity-X6511WVS-06H-C60D48R2_C2883763.html; Insulation Height: 2.5mm; Length of Mating Pin: 6mm

## Sheet Header_Sheet_3.SchDoc
size A; SheetNumber: 9; SheetTotal: 12
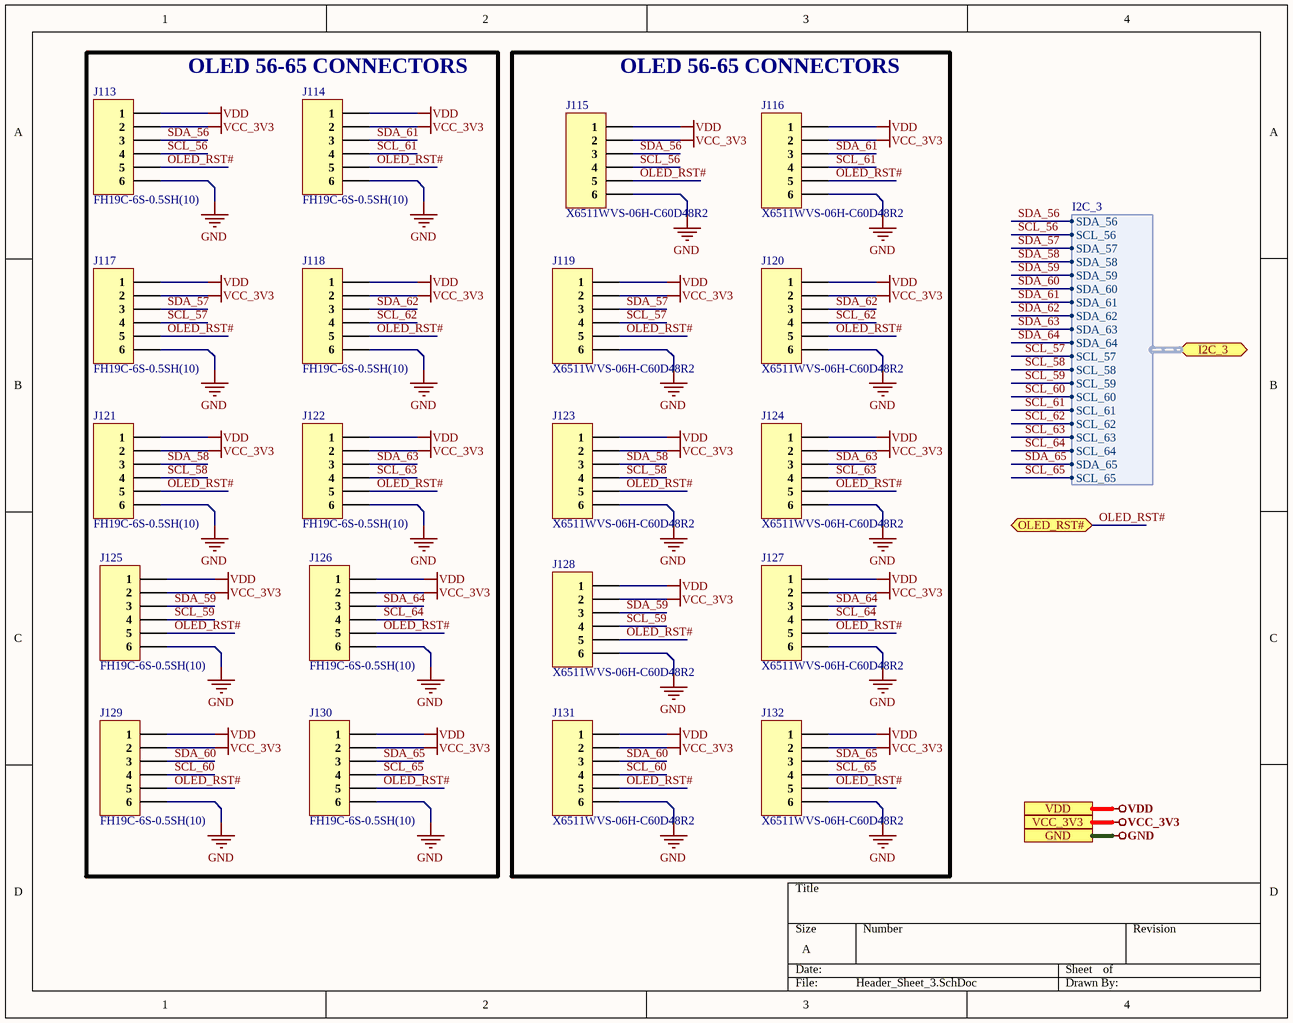
[diagram p8: Header_Sheet_3.SchDoc]

### Parts
J113  FH19C-6S-0.5SH(10)  [FH19C-6S-0.5SH(10)]
J114  FH19C-6S-0.5SH(10)  [FH19C-6S-0.5SH(10)]
J115  X6511WVS-06H-C60D48R2  [X6511WVS-06H-C60D48R2]
J116  X6511WVS-06H-C60D48R2  [X6511WVS-06H-C60D48R2]
J117  FH19C-6S-0.5SH(10)  [FH19C-6S-0.5SH(10)]
J118  FH19C-6S-0.5SH(10)  [FH19C-6S-0.5SH(10)]
J119  X6511WVS-06H-C60D48R2  [X6511WVS-06H-C60D48R2]
J120  X6511WVS-06H-C60D48R2  [X6511WVS-06H-C60D48R2]
J121  FH19C-6S-0.5SH(10)  [FH19C-6S-0.5SH(10)]
J122  FH19C-6S-0.5SH(10)  [FH19C-6S-0.5SH(10)]
J123  X6511WVS-06H-C60D48R2  [X6511WVS-06H-C60D48R2]
J124  X6511WVS-06H-C60D48R2  [X6511WVS-06H-C60D48R2]
J125  FH19C-6S-0.5SH(10)  [FH19C-6S-0.5SH(10)]
J126  FH19C-6S-0.5SH(10)  [FH19C-6S-0.5SH(10)]
J127  X6511WVS-06H-C60D48R2  [X6511WVS-06H-C60D48R2]
J128  X6511WVS-06H-C60D48R2  [X6511WVS-06H-C60D48R2]
J129  FH19C-6S-0.5SH(10)  [FH19C-6S-0.5SH(10)]
J130  FH19C-6S-0.5SH(10)  [FH19C-6S-0.5SH(10)]
J131  X6511WVS-06H-C60D48R2  [X6511WVS-06H-C60D48R2]
J132  X6511WVS-06H-C60D48R2  [X6511WVS-06H-C60D48R2]

### Blocks framed on the sheet
OLED 56-65 CONNECTORS: J113 J114 J117 J118 J121 J122 J125 J126 J129 J130
OLED 56-65 CONNECTORS: J115 J116 J119 J120 J123 J124 J127 J128 J131 J132

### Ports
GND, I2C_3 (bidir, harness I2C_3), OLED_RST# (bidir), VCC_3V3, VDD

### Harnesses
I2C_3: SDA_56, SCL_56, SDA_57, SDA_58, SDA_59, SDA_60, SDA_61, SDA_62, SDA_63, SDA_64, SCL_57, SCL_58, SCL_59, SCL_60, SCL_61, SCL_62, SCL_63, SCL_64, SDA_65, SCL_65

### Nets
GND: J113.6 J114.6 J115.6 J116.6 J117.6 J118.6 J119.6 J120.6 J121.6 J122.6 J123.6 J124.6 J125.6 J126.6 J127.6 J128.6 J129.6 J130.6 J131.6 J132.6 ; port GND
VCC_3V3: J113.2 J114.2 J115.2 J116.2 J117.2 J118.2 J119.2 J120.2 J121.2 J122.2 J123.2 J124.2 J125.2 J126.2 J127.2 J128.2 J129.2 J130.2 J131.2 J132.2 ; port VCC_3V3
VDD: J113.1 J114.1 J115.1 J116.1 J117.1 J118.1 J119.1 J120.1 J121.1 J122.1 J123.1 J124.1 J125.1 J126.1 J127.1 J128.1 J129.1 J130.1 J131.1 J132.1 ; port VDD
OLED_RST#: J113.5 J114.5 J115.5 J116.5 J117.5 J118.5 J119.5 J120.5 J121.5 J122.5 J123.5 J124.5 J125.5 J126.5 J127.5 J128.5 J129.5 J130.5 J131.5 J132.5 ; port OLED_RST#
SCL_56: J113.4 J115.4 ; port I2C_3.SCL_56  [project net I2C_3.SCL_56]
SCL_57: J117.4 J119.4 ; port I2C_3.SCL_57  [project net I2C_3.SCL_57]
SCL_58: J121.4 J123.4 ; port I2C_3.SCL_58  [project net I2C_3.SCL_58]
SCL_59: J125.4 J128.4 ; port I2C_3.SCL_59  [project net I2C_3.SCL_59]
SCL_60: J129.4 J131.4 ; port I2C_3.SCL_60  [project net I2C_3.SCL_60]
SCL_61: J114.4 J116.4 ; port I2C_3.SCL_61  [project net I2C_3.SCL_61]
SCL_62: J118.4 J120.4 ; port I2C_3.SCL_62  [project net I2C_3.SCL_62]
SCL_63: J122.4 J124.4 ; port I2C_3.SCL_63  [project net I2C_3.SCL_63]
SCL_64: J126.4 J127.4 ; port I2C_3.SCL_64  [project net I2C_3.SCL_64]
SCL_65: J130.4 J132.4 ; port I2C_3.SCL_65  [project net I2C_3.SCL_65]
SDA_56: J113.3 J115.3 ; port I2C_3.SDA_56  [project net I2C_3.SDA_56]
SDA_57: J117.3 J119.3 ; port I2C_3.SDA_57  [project net I2C_3.SDA_57]
SDA_58: J121.3 J123.3 ; port I2C_3.SDA_58  [project net I2C_3.SDA_58]
SDA_59: J125.3 J128.3 ; port I2C_3.SDA_59  [project net I2C_3.SDA_59]
SDA_60: J129.3 J131.3 ; port I2C_3.SDA_60  [project net I2C_3.SDA_60]
SDA_61: J114.3 J116.3 ; port I2C_3.SDA_61  [project net I2C_3.SDA_61]
SDA_62: J118.3 J120.3 ; port I2C_3.SDA_62  [project net I2C_3.SDA_62]
SDA_63: J122.3 J124.3 ; port I2C_3.SDA_63  [project net I2C_3.SDA_63]
SDA_64: J126.3 J127.3 ; port I2C_3.SDA_64  [project net I2C_3.SDA_64]
SDA_65: J130.3 J132.3 ; port I2C_3.SDA_65  [project net I2C_3.SDA_65]

### Library data of the parts
J113 J114 J117 J118 J121 J122 J125 J126 J129 J130 = FH19C-6S-0.5SH(10): as J1 on sheet Connector_Sheet_1; Supplier 1: Digi-Key; Manufacturer Part Number: FH19C-6S-0.5SH(10); RoHS: Yes; Category: FFC / FPC; Stock 1: 1159; Pricing 1: 1=1.10000, 10=0.96900, 25=0.91200, 50=0.87400, 100=0.83600, 250=0.76000, 500=0.68400, 1000=0.60800, 2500=0.55100 (USD); ComponentLink1URL: https://datasheet.ciiva.com/18563/ed-fh19cfh19sc-20140305-18563530.pdf?src-supplier=Digi-Key; ComponentLink1Description: https://datasheet.ciiva.com/18563/ed-fh19cfh19sc-20140305-18563530.pdf?src-supplier=Digi-Key; Supplier Part Number 1: H125824CT-ND
J115 J116 J119 J120 J123 J124 J127 J128 J131 J132 = X6511WVS-06H-C60D48R2: as J45 on sheet Header_Sheet_1; ComponentLink1Description: LCSC; ComponentLink1URL: https://lcsc.com/product-detail/span-style-background-color-ff0-Pin-span-Headers_XKB-Connectivity-X6511WVS-06H-C60D48R2_C2883763.html; Insulation Height: 2.5mm; Length of Mating Pin: 6mm